# EasyEDA Pro project six-port-baseboard-v01.epro, schematic 六接口底板_V01, sheets 5 to 10 of 12

## Sheets
5 02_FR胎温控制器: Schematic Name: 六接口底板_V01
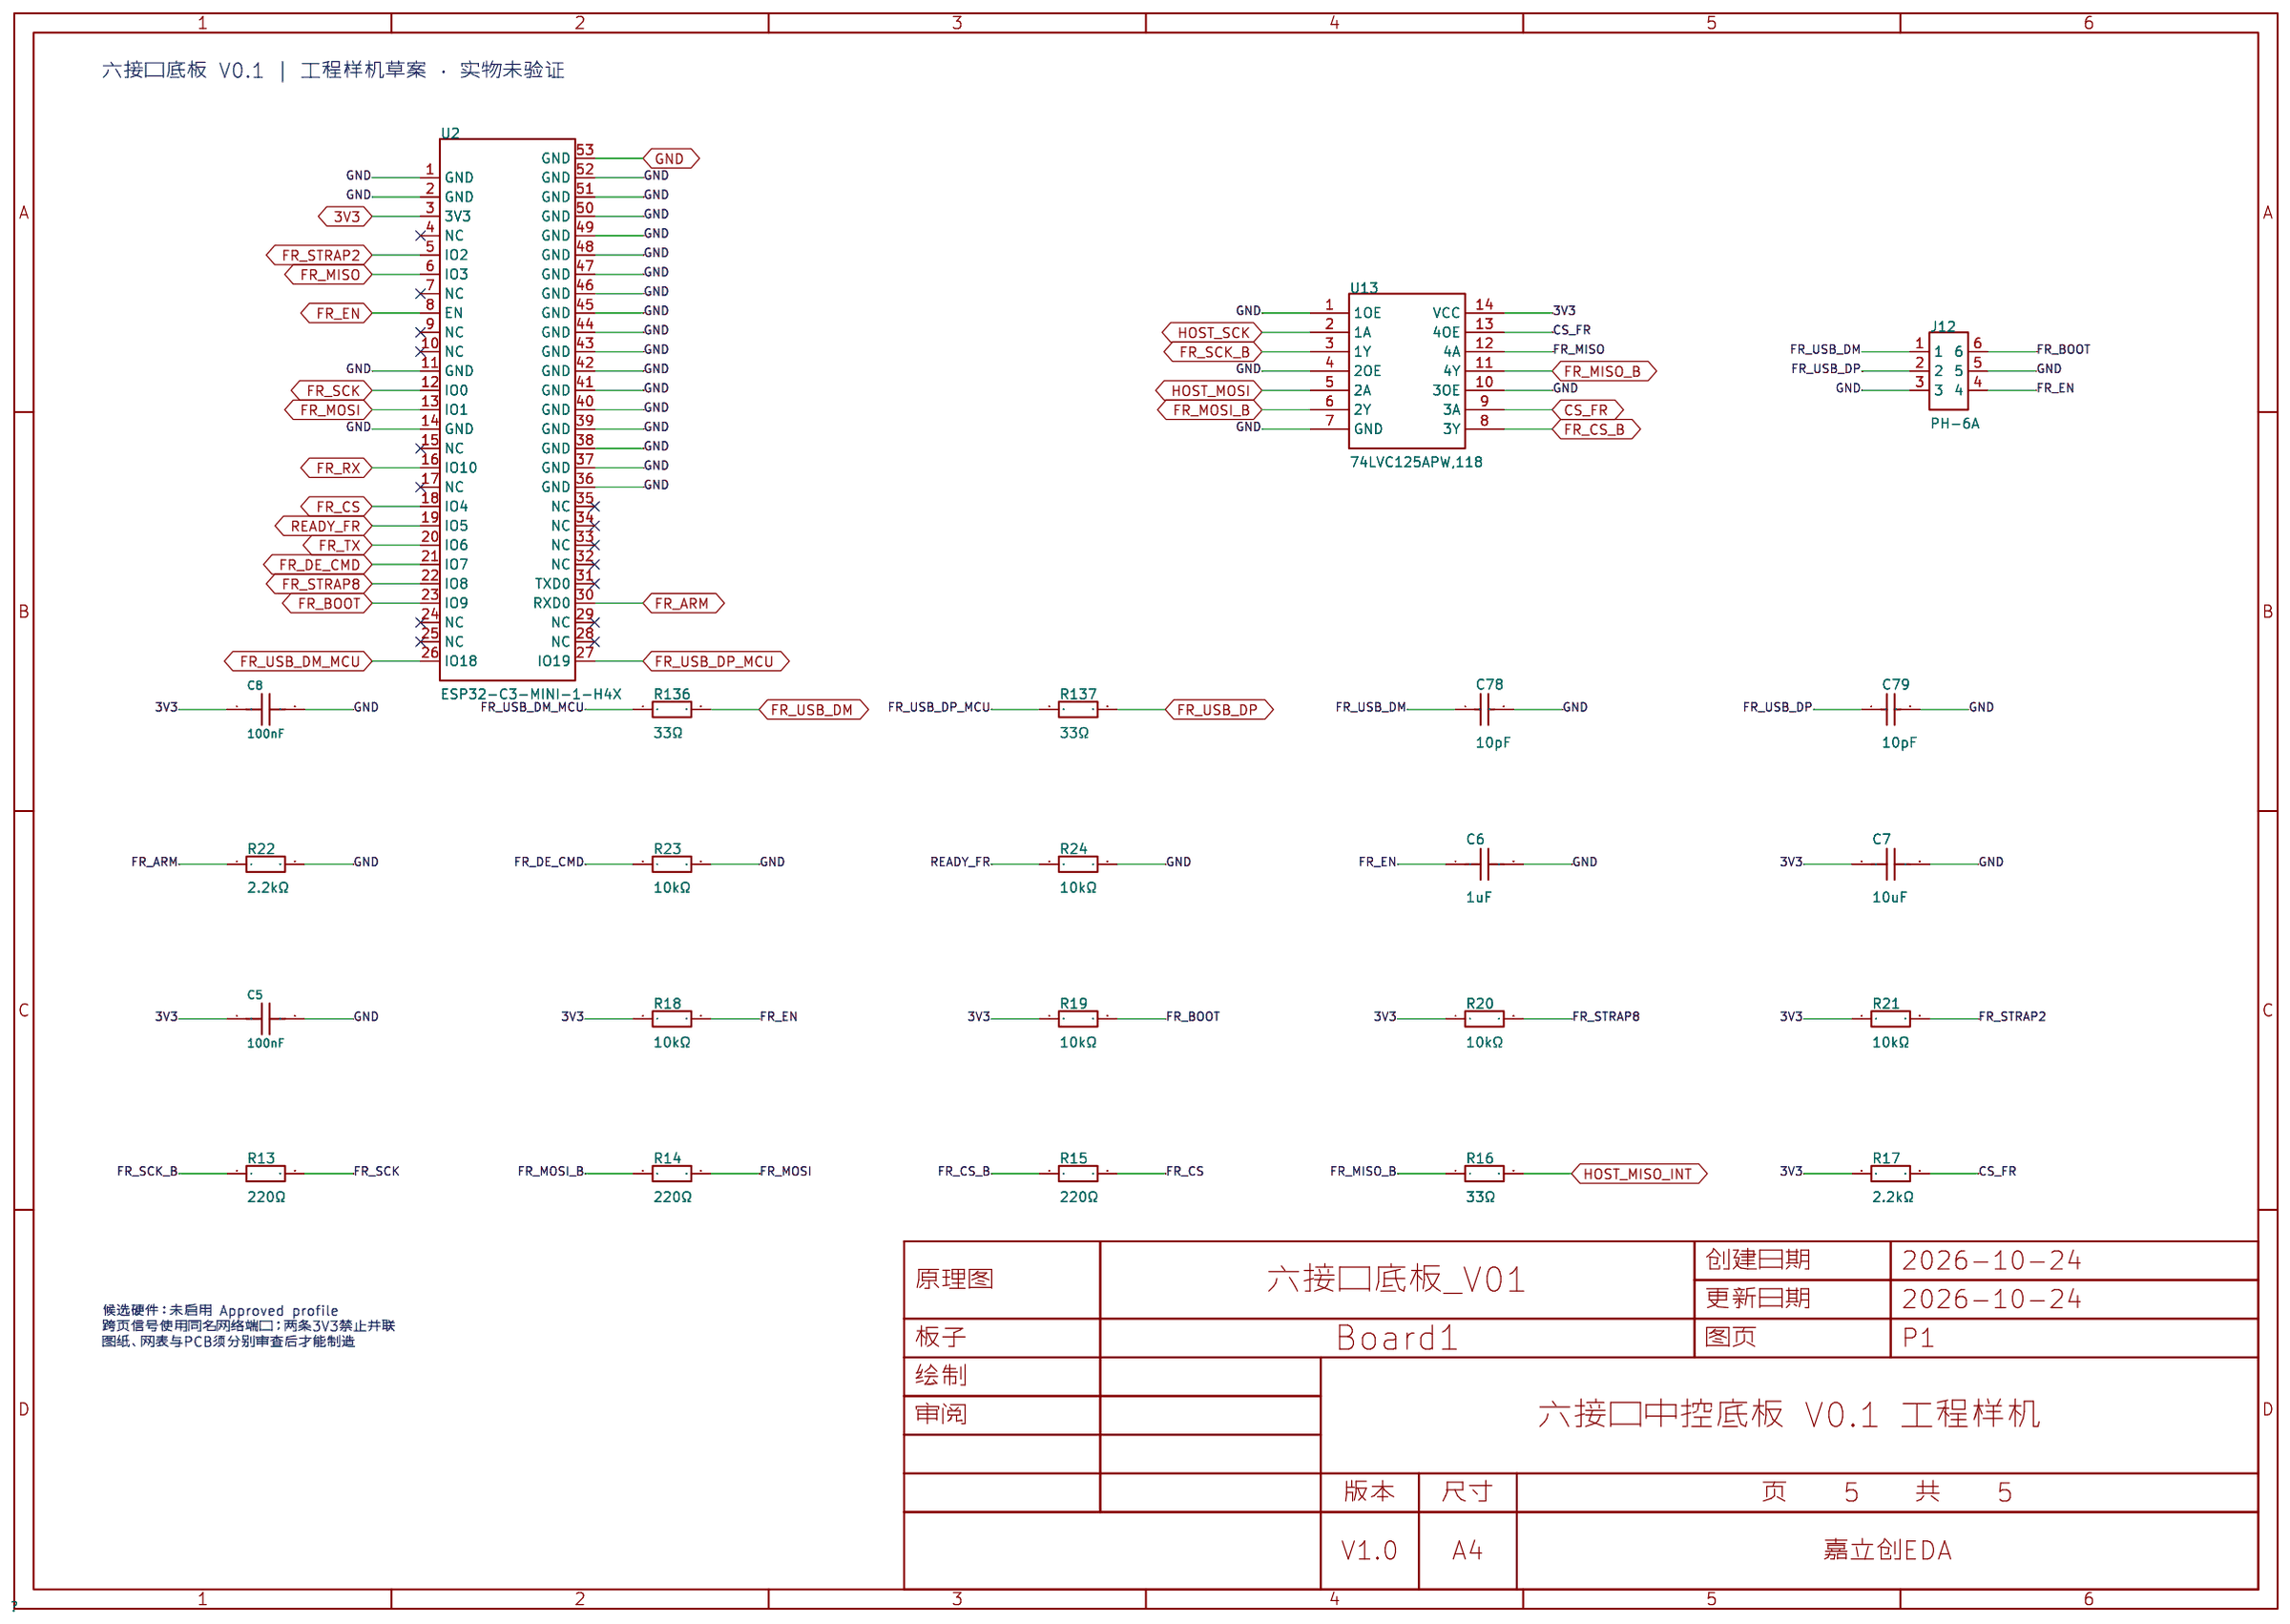
[diagram p4: 02_FR胎温控制器]
6 03_RL胎温控制器: Schematic Name: 六接口底板_V01
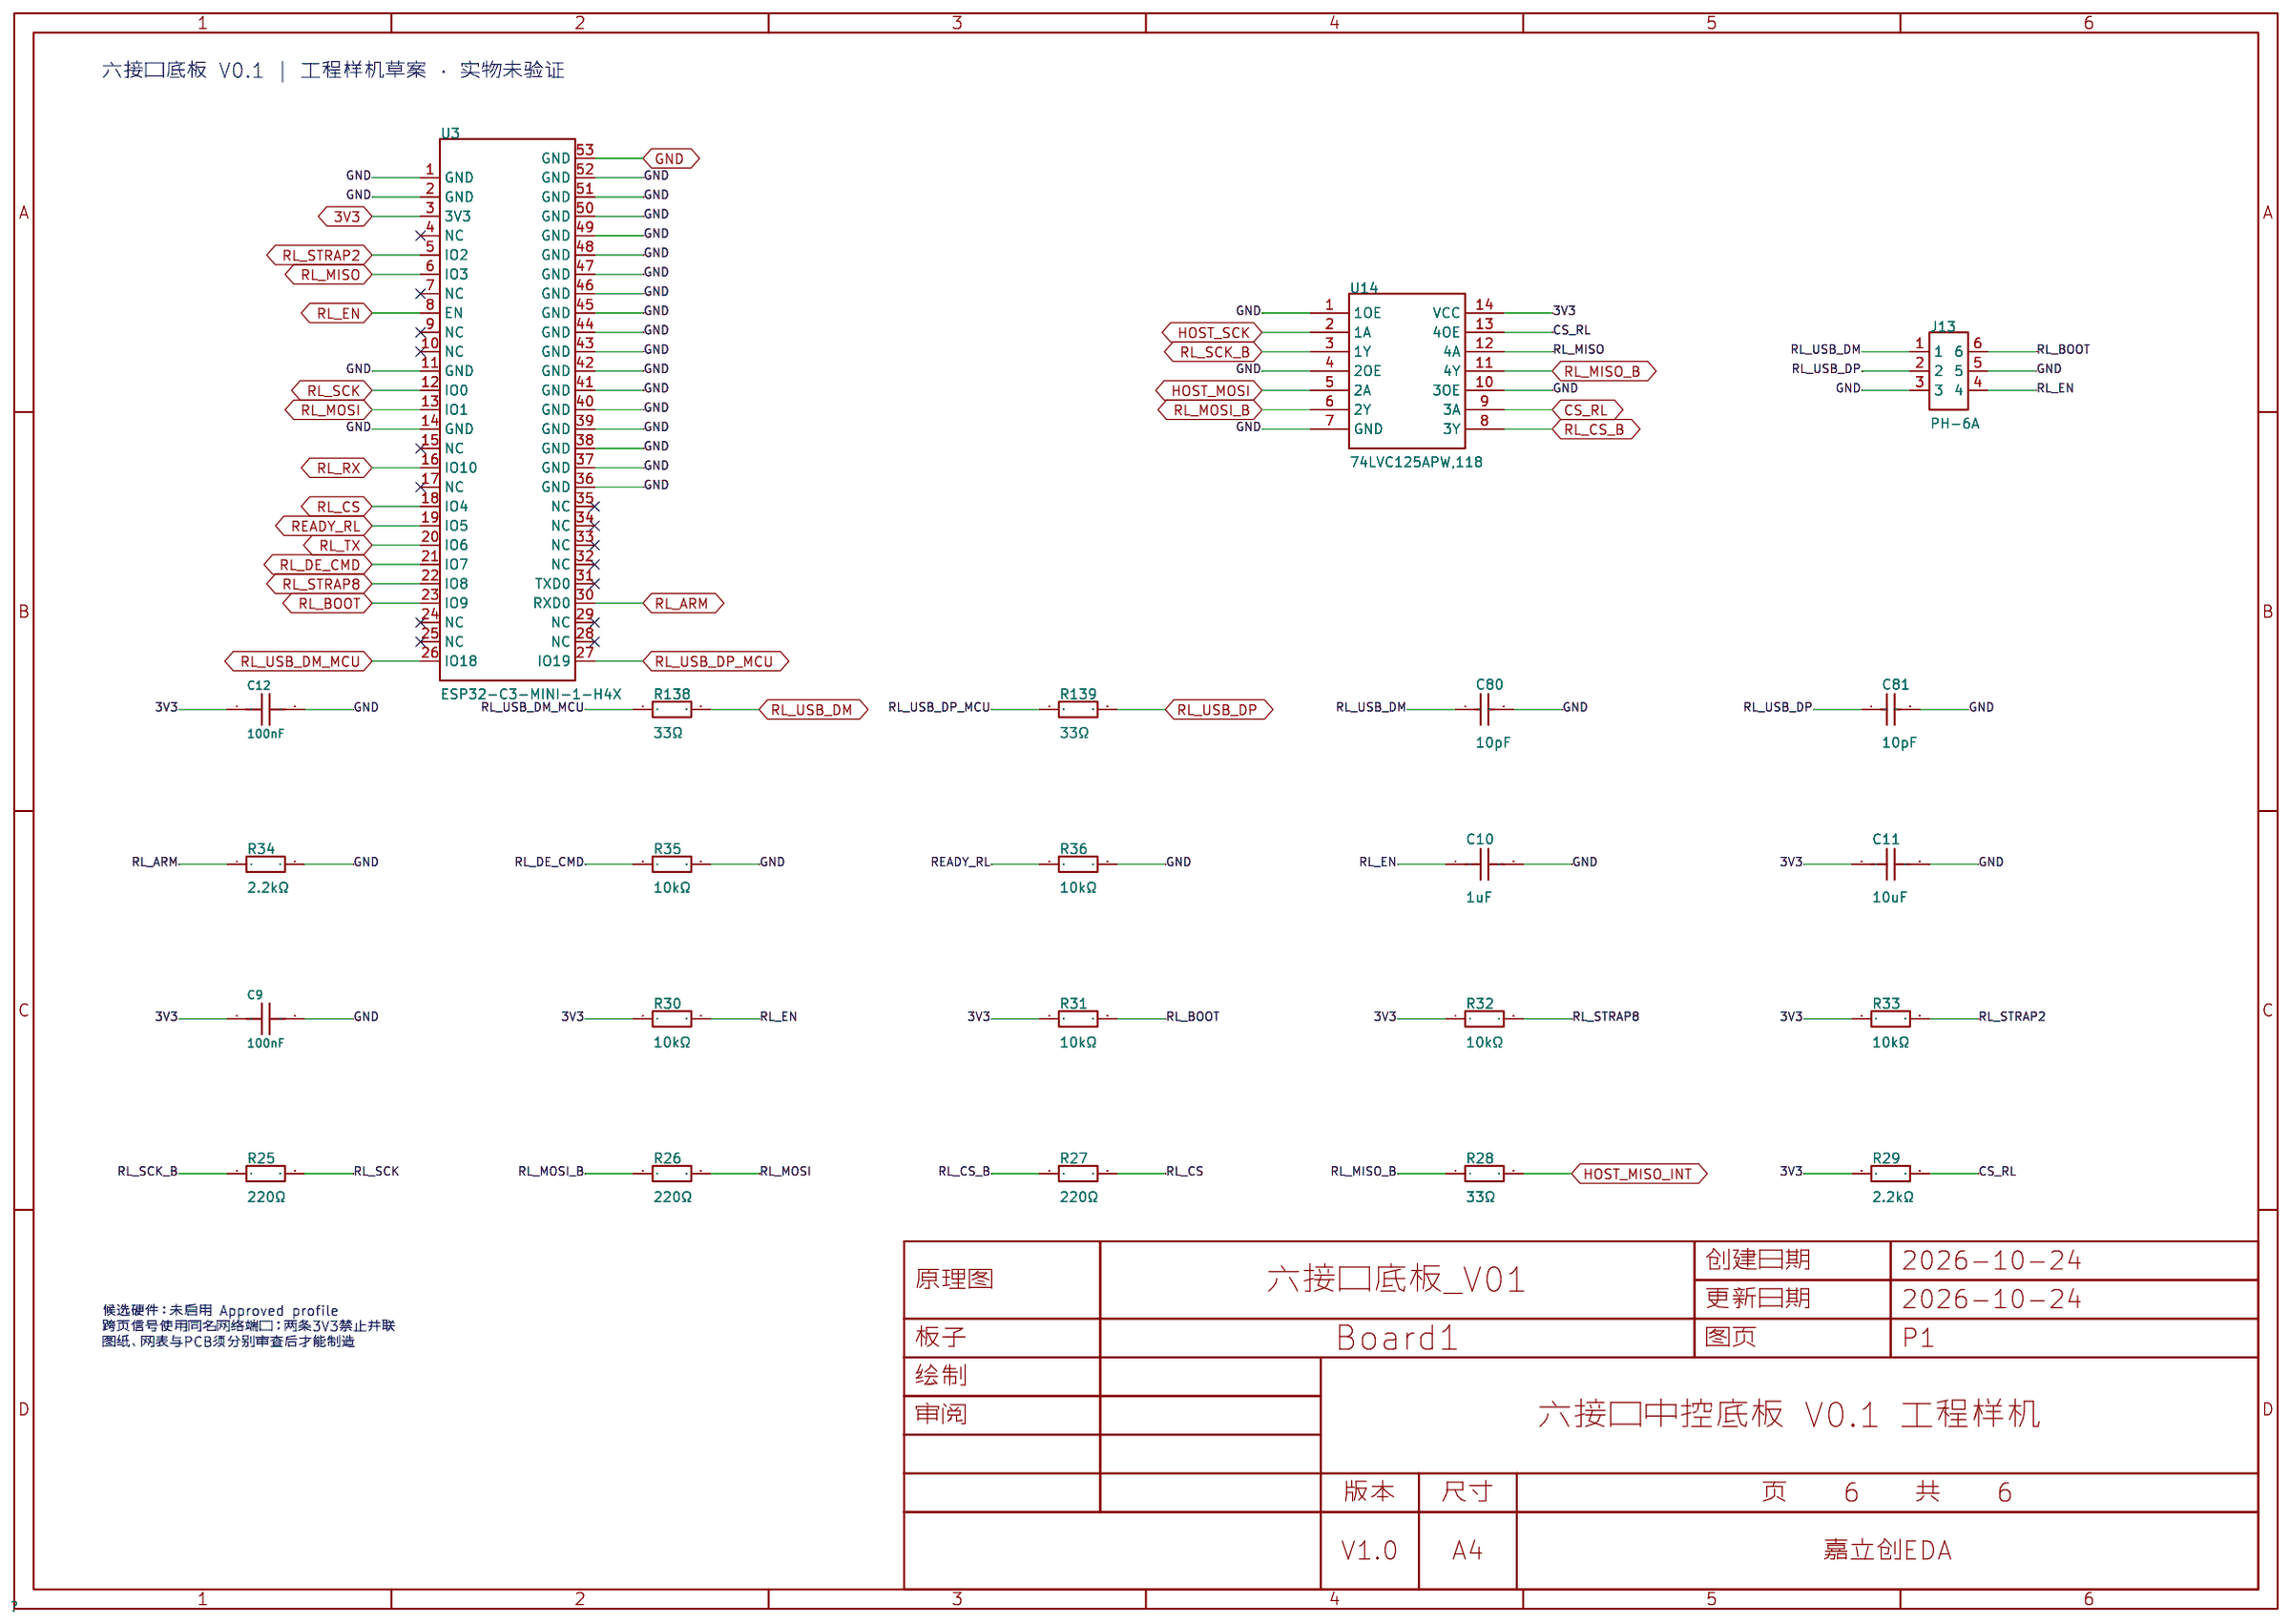
[diagram p5: 03_RL胎温控制器]
7 04_RR胎温控制器: Schematic Name: 六接口底板_V01
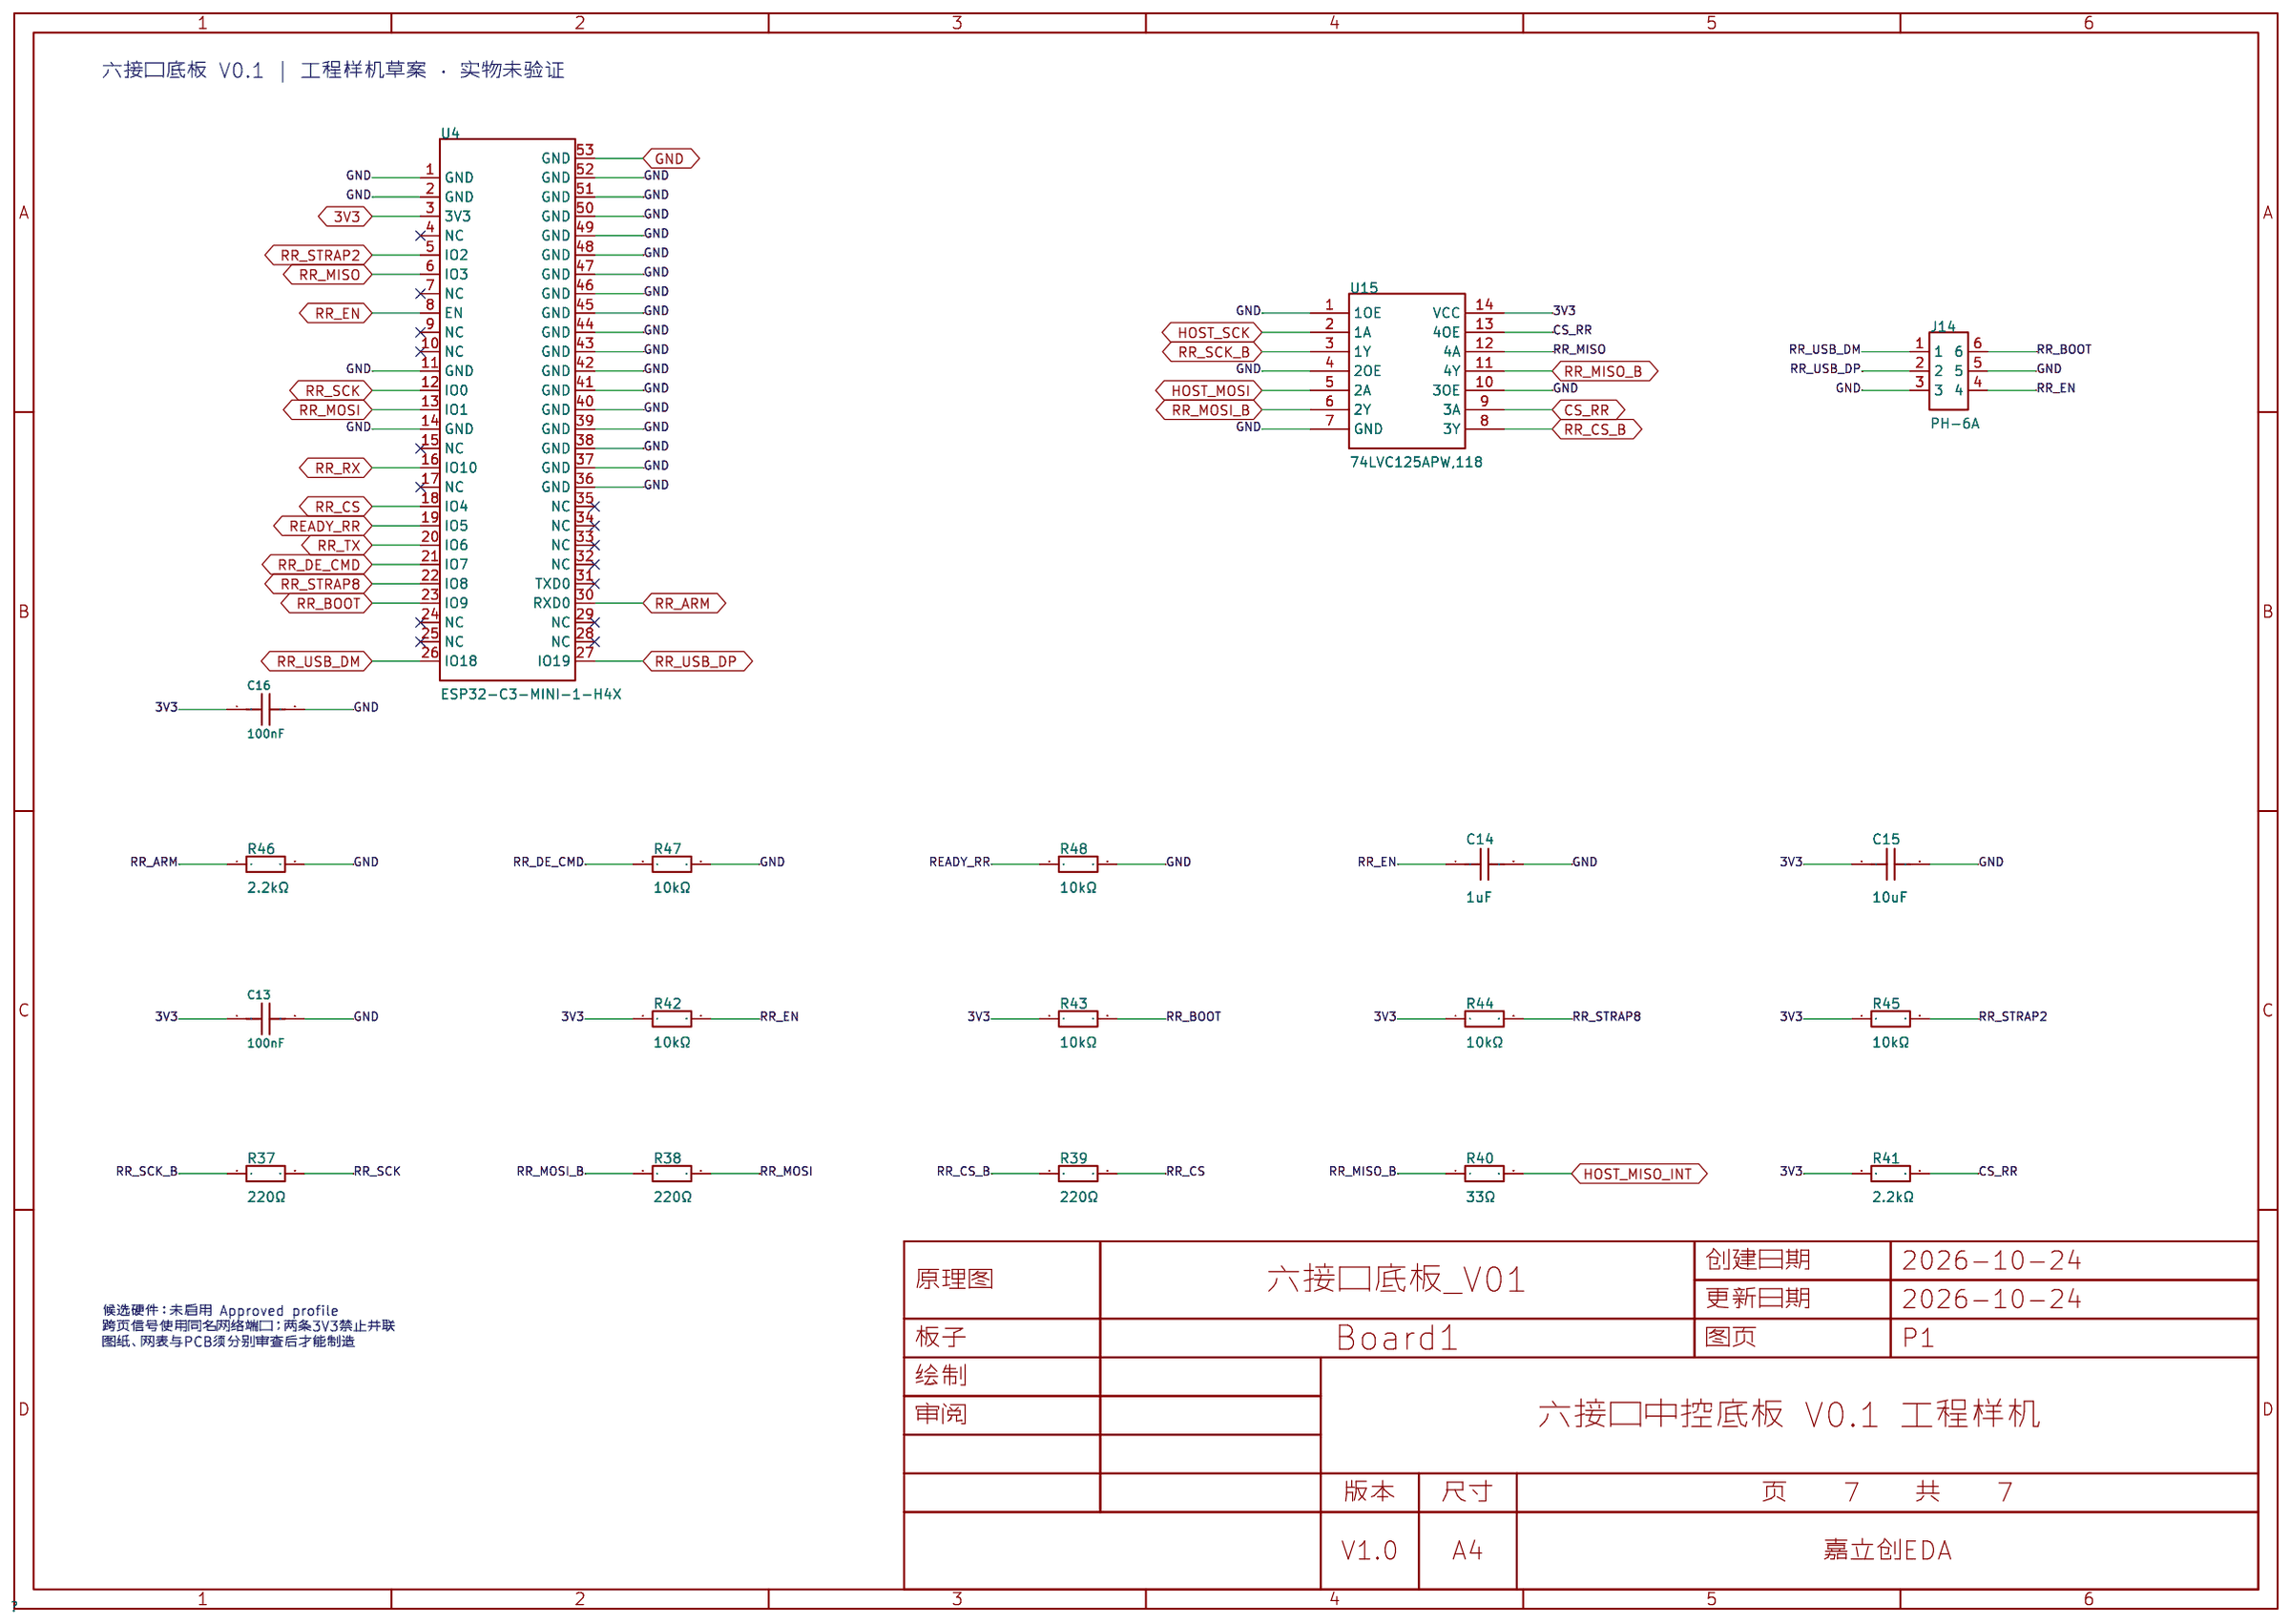
[diagram p6: 04_RR胎温控制器]
8 08_7B与READY选择: Schematic Name: 六接口底板_V01
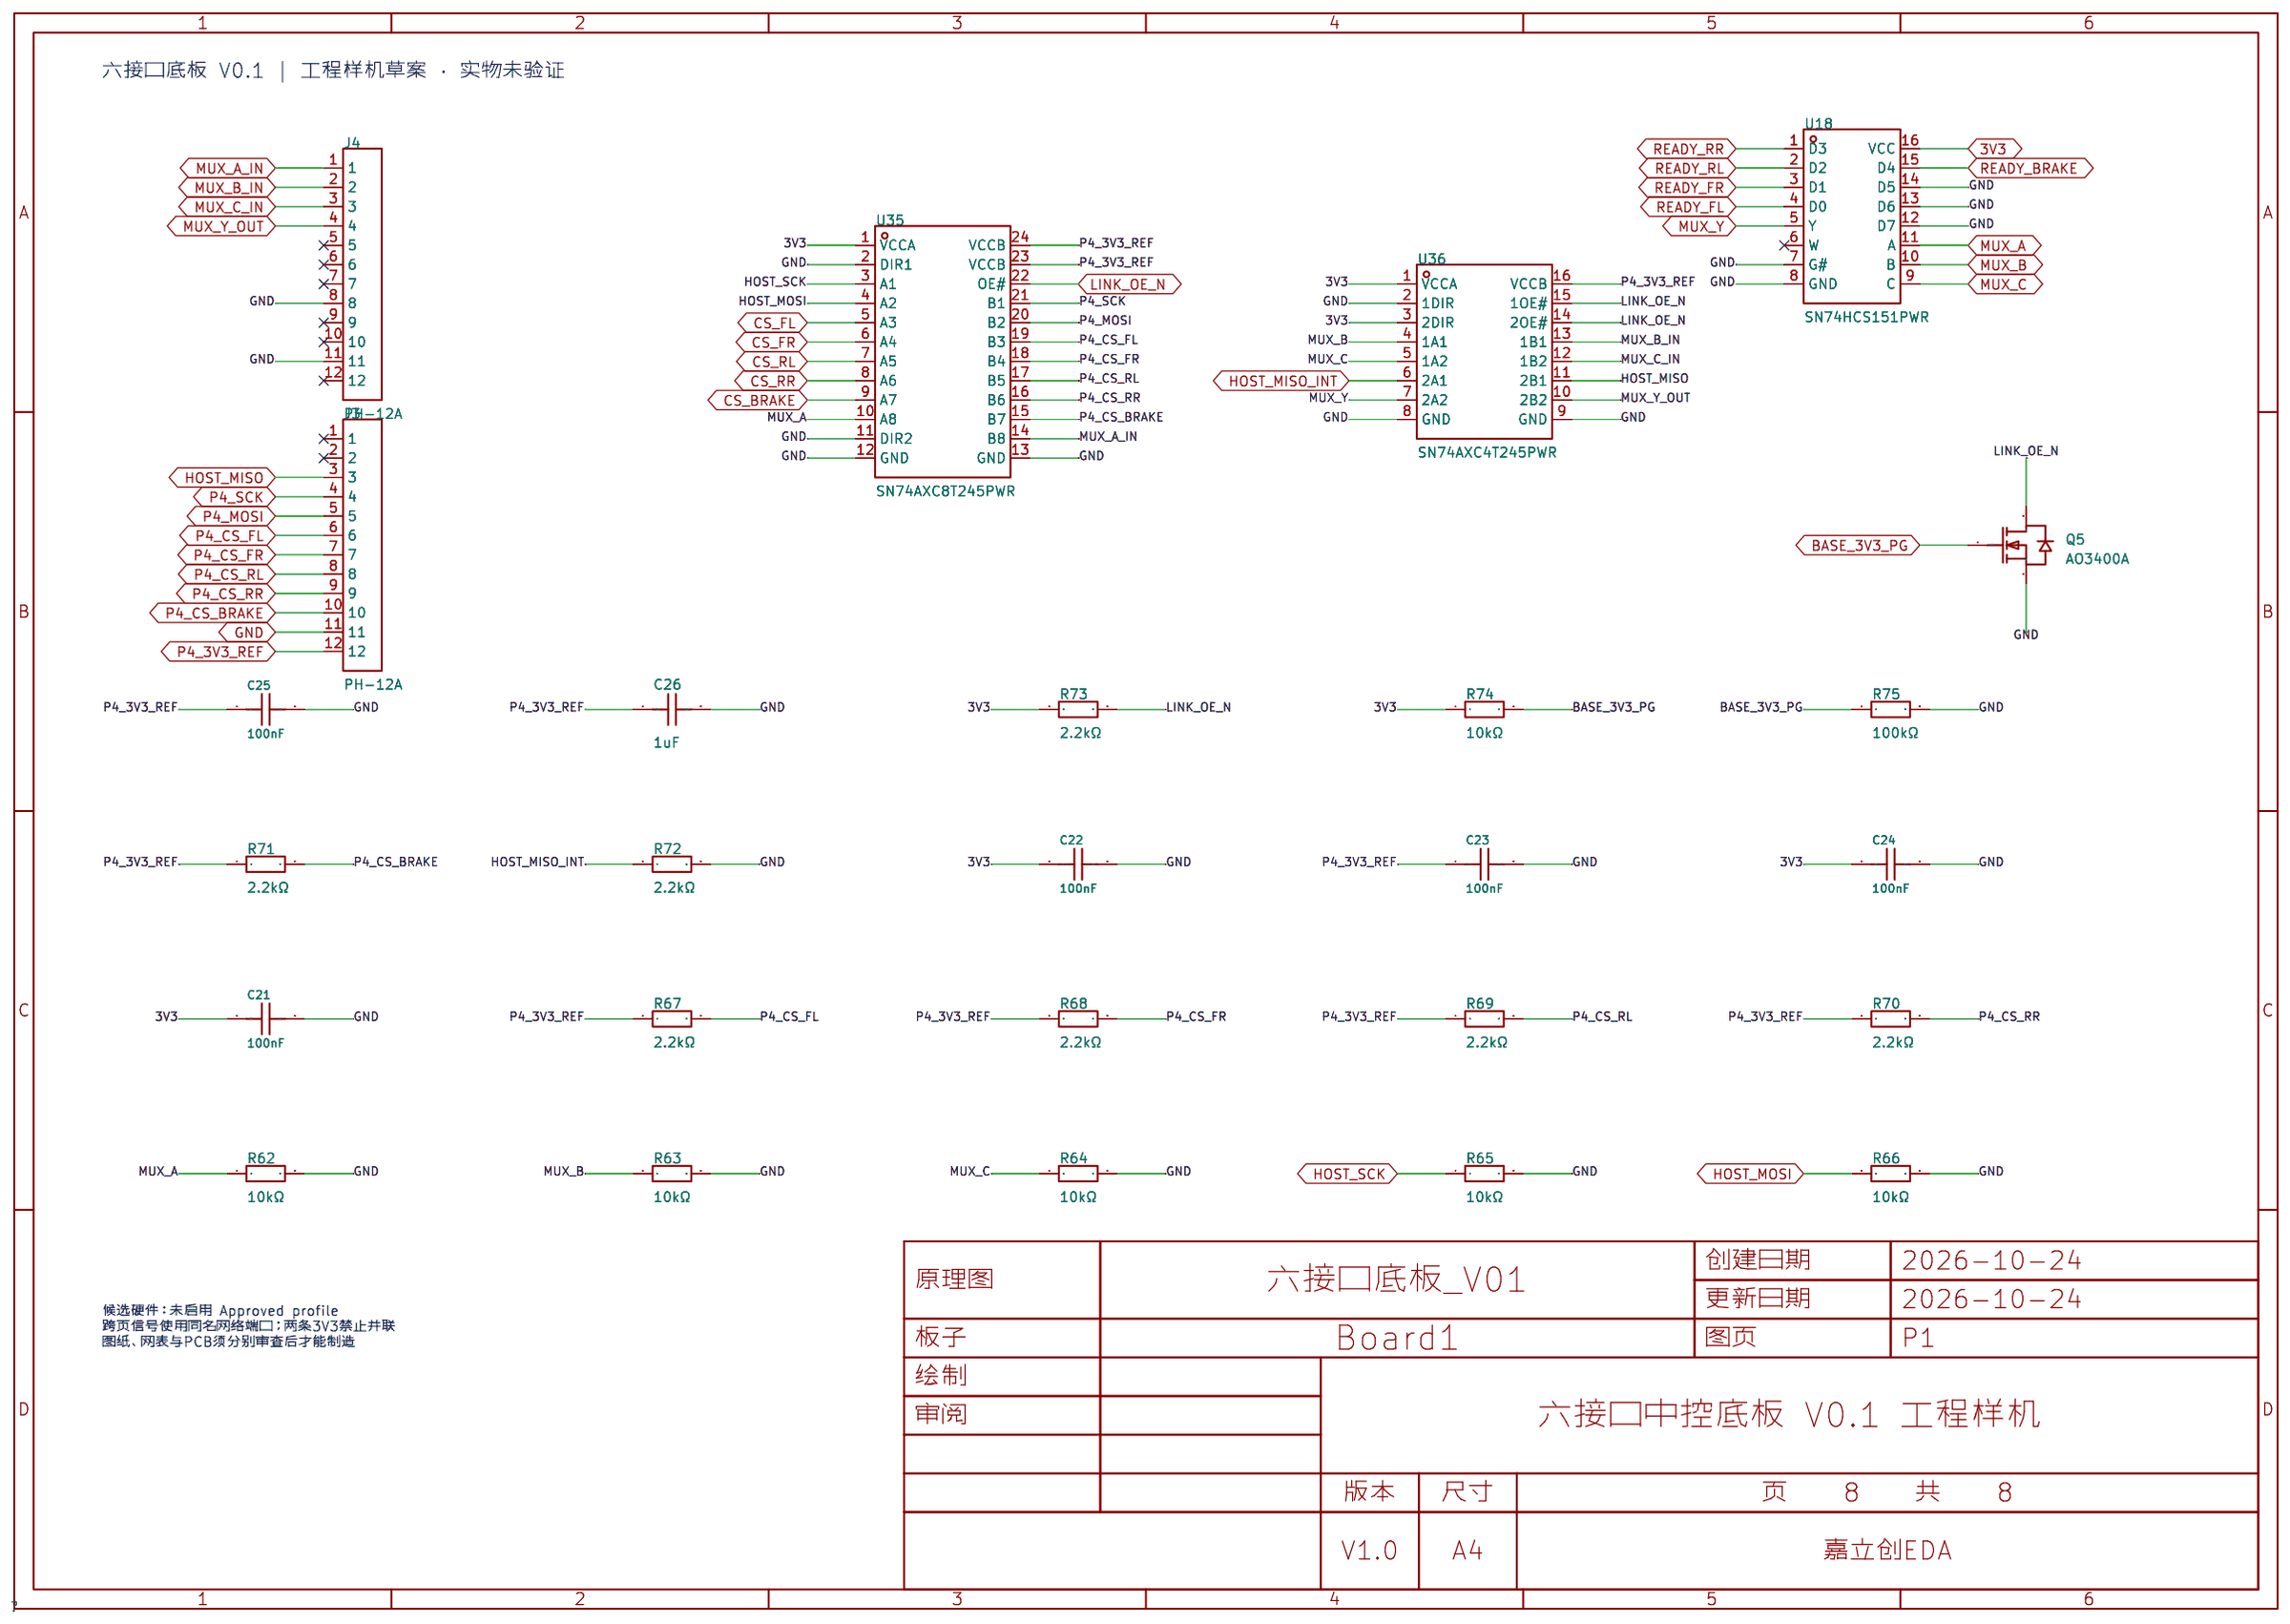
[diagram p7: 08_7B与READY选择]
9 09_双路降压与屏幕电源: Schematic Name: 六接口底板_V01
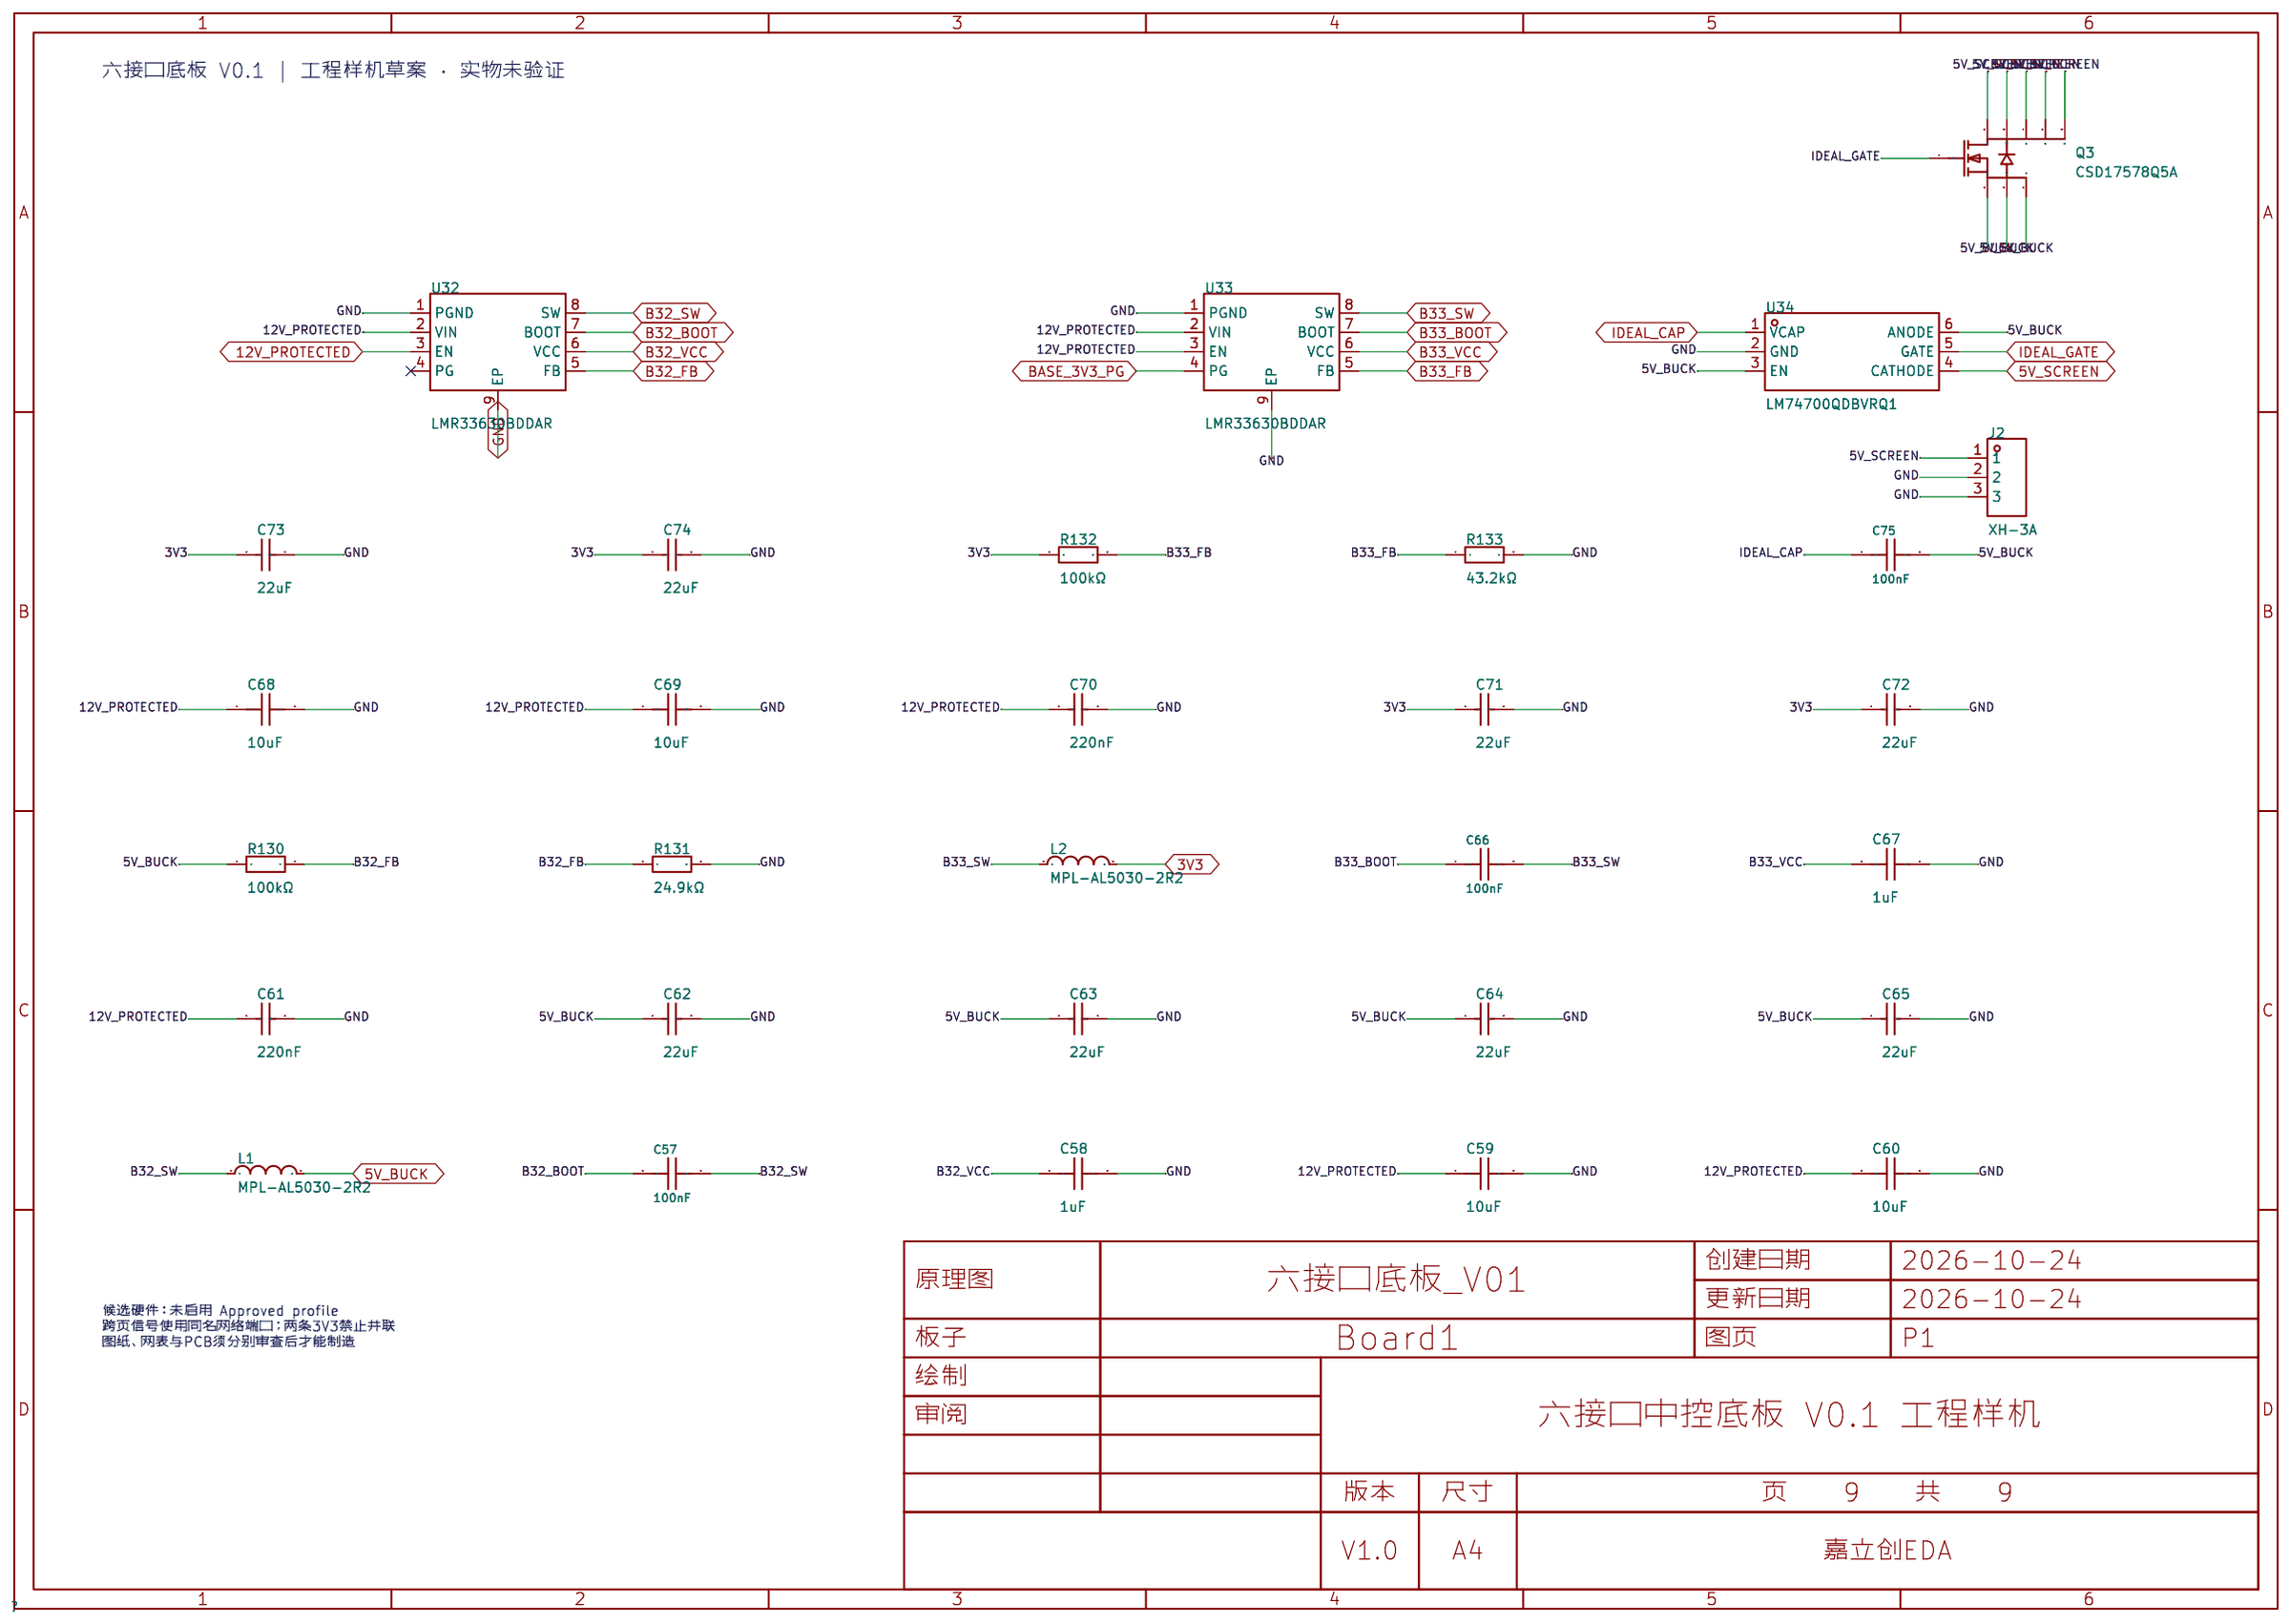
[diagram p8: 09_双路降压与屏幕电源]
10 10_FL-FR支路无源器件: Schematic Name: 六接口底板_V01
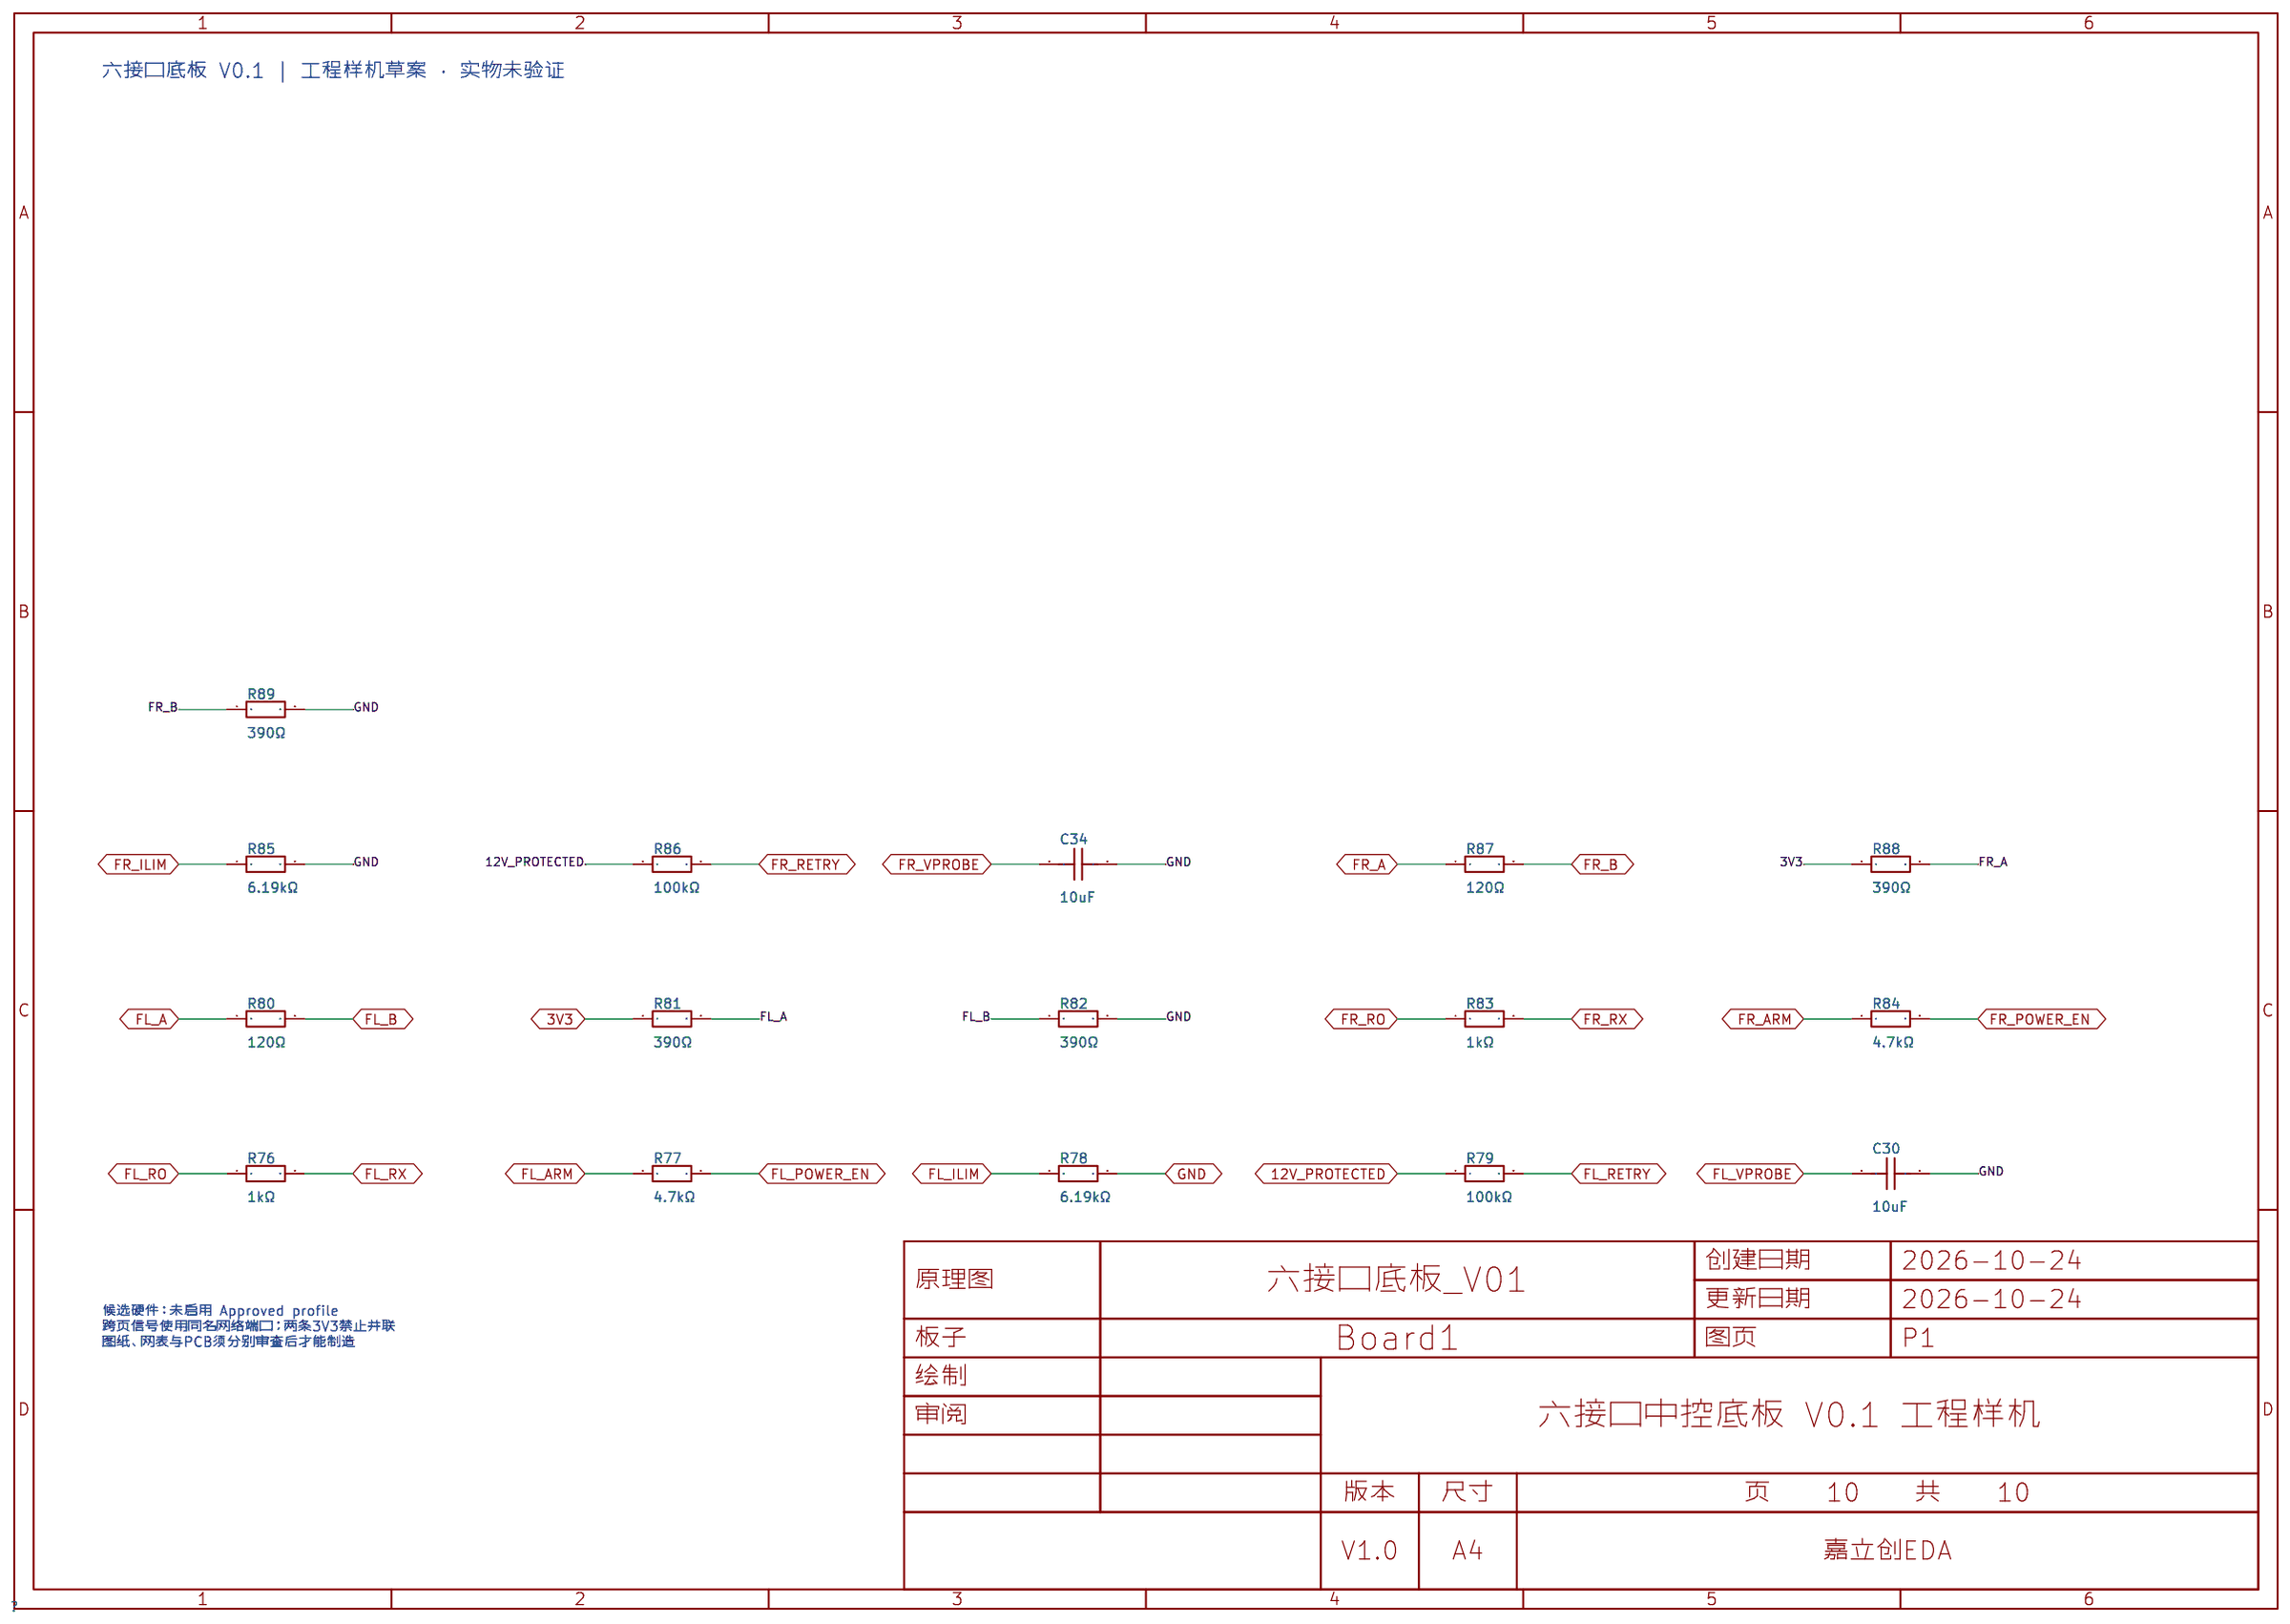
[diagram p9: 10_FL-FR支路无源器件]

## Parts
sheet 02_FR胎温控制器
C5  100nF  [C0603]
C6  1uF  [C0603]
C7  10uF  [C0805]
C8  100nF  [C0603]
C78  10pF  [C0603]  (no BOM)
C79  10pF  [C0603]  (no BOM)
J12  PH-6A  [CONN-TH_6P-P2.00_B6B-PH-K-1]
R13  220Ω  [R0603]
R14  220Ω  [R0603]
R15  220Ω  [R0603]
R16  33Ω  [R0603]
R17  2.2kΩ  [R0603]
R18  10kΩ  [R0603]
R19  10kΩ  [R0603]
R20  10kΩ  [R0603]
R21  10kΩ  [R0603]
R22  2.2kΩ  [R0603]
R23  10kΩ  [R0603]
R24  10kΩ  [R0603]
R136  33Ω  [R0603]
R137  33Ω  [R0603]
U2  2.4GHz  [WIFIM-SMD_ESP32-C3-MINI-1]
U13  74LVC125APW,118  [TSSOP-14_L5.0-W4.4-P0.65-LS6.4-BL]
sheet 03_RL胎温控制器
C9  100nF  [C0603]
C10  1uF  [C0603]
C11  10uF  [C0805]
C12  100nF  [C0603]
C80  10pF  [C0603]  (no BOM)
C81  10pF  [C0603]  (no BOM)
J13  PH-6A  [CONN-TH_6P-P2.00_B6B-PH-K-1]
R25  220Ω  [R0603]
R26  220Ω  [R0603]
R27  220Ω  [R0603]
R28  33Ω  [R0603]
R29  2.2kΩ  [R0603]
R30  10kΩ  [R0603]
R31  10kΩ  [R0603]
R32  10kΩ  [R0603]
R33  10kΩ  [R0603]
R34  2.2kΩ  [R0603]
R35  10kΩ  [R0603]
R36  10kΩ  [R0603]
R138  33Ω  [R0603]
R139  33Ω  [R0603]
U3  2.4GHz  [WIFIM-SMD_ESP32-C3-MINI-1]
U14  74LVC125APW,118  [TSSOP-14_L5.0-W4.4-P0.65-LS6.4-BL]
sheet 04_RR胎温控制器
C13  100nF  [C0603]
C14  1uF  [C0603]
C15  10uF  [C0805]
C16  100nF  [C0603]
J14  PH-6A  [CONN-TH_6P-P2.00_B6B-PH-K-1]
R37  220Ω  [R0603]
R38  220Ω  [R0603]
R39  220Ω  [R0603]
R40  33Ω  [R0603]
R41  2.2kΩ  [R0603]
R42  10kΩ  [R0603]
R43  10kΩ  [R0603]
R44  10kΩ  [R0603]
R45  10kΩ  [R0603]
R46  2.2kΩ  [R0603]
R47  10kΩ  [R0603]
R48  10kΩ  [R0603]
U4  2.4GHz  [WIFIM-SMD_ESP32-C3-MINI-1]
U15  74LVC125APW,118  [TSSOP-14_L5.0-W4.4-P0.65-LS6.4-BL]
sheet 08_7B与READY选择
C21  100nF  [C0603]
C22  100nF  [C0603]
C23  100nF  [C0603]
C24  100nF  [C0603]
C25  100nF  [C0603]
C26  1uF  [C0603]
J3  PH-12A  [CONN-TH_PH-12A]
J4  PH-12A  [CONN-TH_PH-12A]
Q5  AO3400A  [SOT-23-3_L2.9-W1.3-P1.90-LS2.4-BR]
R62  10kΩ  [R0603]
R63  10kΩ  [R0603]
R64  10kΩ  [R0603]
R65  10kΩ  [R0603]
R66  10kΩ  [R0603]
R67  2.2kΩ  [R0603]
R68  2.2kΩ  [R0603]
R69  2.2kΩ  [R0603]
R70  2.2kΩ  [R0603]
R71  2.2kΩ  [R0603]
R72  2.2kΩ  [R0603]
R73  2.2kΩ  [R0603]
R74  10kΩ  [R0603]
R75  100kΩ  [R0603]
U18  SN74HCS151PWR  [TSSOP-16_L5.0-W4.4-P0.65-LS6.4-BL]
U35  SN74AXC8T245PWR  [TSSOP-24_L7.8-W4.4-P0.65-LS6.4-BL]
U36  SN74AXC4T245PWR  [TSSOP-16_L5.0-W4.4-P0.65-LS6.4-BL]
sheet 09_双路降压与屏幕电源
C57  100nF  [C0603]
C58  1uF  [C0603]
C59  10uF  [C0805]
C60  10uF  [C0805]
C61  220nF  [C0603]
C62  22uF  [C1206]
C63  22uF  [C1206]
C64  22uF  [C1206]
C65  22uF  [C1206]
C66  100nF  [C0603]
C67  1uF  [C0603]
C68  10uF  [C0805]
C69  10uF  [C0805]
C70  220nF  [C0603]
C71  22uF  [C1206]
C72  22uF  [C1206]
C73  22uF  [C1206]
C74  22uF  [C1206]
C75  100nF  [C0603]
J2  XH-3A  [CONN-TH_XH-3A]
L1  2.2uH  [IND-SMD_L5.5-W5.3_XGL5030]
L2  2.2uH  [IND-SMD_L5.5-W5.3_XGL5030]
Q3  CSD17578Q5A  [DFN-8_L5.8-W4.9-P1.27-LS6.0-BL-1]
R130  100kΩ  [R0603]
R131  24.9kΩ  [R0603]
R132  100kΩ  [R0603]
R133  43.2kΩ  [R0603]
U32  LMR33630BDDAR  [SOIC-8_L4.9-W3.9-P1.27-LS6.0-BL-EP2.8-1]
U33  LMR33630BDDAR  [SOIC-8_L4.9-W3.9-P1.27-LS6.0-BL-EP2.8-1]
U34  LM74700QDBVRQ1  [SOT-23-6_L2.9-W1.6-P0.95-LS2.8-BR]
sheet 10_FL-FR支路无源器件
C30  10uF  [C0805]
C34  10uF  [C0805]
R76  1kΩ  [R0603]
R77  4.7kΩ  [R0603]
R78  6.19kΩ  [R0603]
R79  100kΩ  [R0603]
R80  120Ω  [R0603]  (no BOM)
R81  390Ω  [R0603]  (no BOM)
R82  390Ω  [R0603]  (no BOM)
R83  1kΩ  [R0603]
R84  4.7kΩ  [R0603]
R85  6.19kΩ  [R0603]
R86  100kΩ  [R0603]
R87  120Ω  [R0603]  (no BOM)
R88  390Ω  [R0603]  (no BOM)
R89  390Ω  [R0603]  (no BOM)

## Library data of the parts
C5 C8 C9 C12 C13 C16 C21-C25 C57 C66 C75 = CC0603KRX7R9BB104: 容值:100nF;精度:±10%;额定电压:50V;温度系数:X7R;; LCSC Part Name: 100nF ±10% 50V; Supplier Part: C14663; Manufacturer: YAGEO(国巨); Supplier Footprint: 0603; JLCPCB Part Class: Basic Part; Datasheet: https://item.szlcsc.com/datasheet/CC0603KRX7R9BB104/15331.html; Supplier: LCSC; Tolerance: ±10%; Voltage Rating: 50V; Temperature Coefficient: X7R; Catalog UUID: 96b39256cc3f4d80bd3b503deb4f3328; DNP: false
C6 C10 C14 C26 C58 C67 = CL10A105KB8NNNC: 容值:1uF;精度:±10%;额定电压:50V;温度系数:X5R;; LCSC Part Name: 1uF ±10% 50V; Supplier Part: C15849; Manufacturer: SAMSUNG(三星); Supplier Footprint: 0603; JLCPCB Part Class: Basic Part; Datasheet: https://item.szlcsc.com/datasheet/CL10A105KB8NNNC/16531.html; Supplier: LCSC; Tolerance: ±10%; Voltage Rating: 50V; Temperature Coefficient: X5R; Catalog UUID: f4744ff7405a46a48e360c2c6fadeca3; DNP: false
C7 C11 C15 C30 C34 = CL21A106KAYNNNE_C15850: 容值:10uF;精度:±10%;额定电压:25V;温度系数:X5R;; LCSC Part Name: 10uF ±10% 25V; Supplier Part: C15850; Manufacturer: SAMSUNG(三星); Manufacturer Part: CL21A106KAYNNNE; Supplier Footprint: 0805; JLCPCB Part Class: Basic Part; Datasheet: https://item.szlcsc.com/datasheet/CL21A106KAYNNNE/16532.html; Supplier: LCSC; Tolerance: ±10%; Voltage Rating: 25V; Temperature Coefficient: X5R; Catalog UUID: 8c1f4a9e9d204b148b36ce719c891bd1; DNP: false
C78-C81 = CL10C100JB8NNNC: 容值:10pF;精度:±5%;额定电压:50V;温度系数:C0G;; LCSC Part Name: 10pF ±5% 50V; Supplier Part: C1634; Manufacturer: SAMSUNG(三星); Supplier Footprint: 0603; JLCPCB Part Class: Basic Part; Datasheet: https://item.szlcsc.com/datasheet/CL10C100JB8NNNC/1986.html; Supplier: LCSC; Tolerance: ±5%; Voltage Rating: 50V; Temperature Coefficient: C0G; Catalog UUID: cce6c24475c147de9dedbc04bb9e84e4; DNP: true; Engineering Note: USB tuning10pF reserve; DNP initially; do not fit without signal-integrity validation
J12-J14 = PH-6A: Supplier Part: C9900011373; JLCPCB Part Class: Extended Part; Supplier: LCSC; Catalog UUID: 557868997cb2445e94ef98c066678616; DNP: false; Engineering Note: Native USB jig only; no VBUS or UART0 RX; external 12V supply required
R13-R15 R25-R27 R37-R39 = 0603WAF2200T5E: 电阻类型:厚膜电阻;阻值:220Ω;精度:±1%;功率:100mW;最大工作电压:75V;温度系数:±100ppm/℃;; LCSC Part Name: 220Ω ±1% 100mW 厚膜电阻; Supplier Part: C22962; Manufacturer: UNI-ROYAL(厚声); Supplier Footprint: 0603; JLCPCB Part Class: Basic Part; Datasheet: https://atta.szlcsc.com/upload/public/pdf/source/20200306/C422600_1E6D84923E4A46A82E41ADD87F860B5C.pdf; Supplier: LCSC; Type: 厚膜电阻; Tolerance: ±1%; Power(Watts): 100mW; Overload Voltage (Max): 75V; Temperature Coefficient: ±100ppm/℃; Operating Temperature Range: -55℃~+155℃; Catalog UUID: 5838c5089bf2441c9c491337f593e7a2; DNP: false
R16 R28 R40 = 0603WAF330JT5E: 电阻类型:厚膜电阻;阻值:33Ω;精度:±1%;功率:100mW;工作电压:75V;温度系数:±100ppm/℃;; LCSC Part Name: 33Ω ±1% 100mW 厚膜电阻; Supplier Part: C23140; Manufacturer: UNI-ROYAL(厚声); Supplier Footprint: 0603; JLCPCB Part Class: Basic Part; Datasheet: https://item.szlcsc.com/datasheet/0603WAF330JT5E/23867.html; Supplier: LCSC; Type: 厚膜电阻; Tolerance: ±1%; Power(Watts): 100mW; Voltage-Supply(Max): 75V; Temperature Coefficient: ±100ppm/℃; Operating Temperature: -55℃~+155℃; Catalog UUID: c1b17fa23f304726bc91c5924d9b7c0f; DNP: false
R17 R22 R29 R34 R41 R46 R67-R73 = 0603WAF2201T5E: 电阻类型:厚膜电阻;阻值:2.2kΩ;精度:±1%;功率:100mW;工作电压:75V;温度系数:±100ppm/℃;; LCSC Part Name: 厚膜电阻 2.2kΩ ±1%; Supplier Part: C4190; Manufacturer: UNI-ROYAL(厚声); Supplier Footprint: 0603; JLCPCB Part Class: Basic Part; Datasheet: https://item.szlcsc.com/datasheet/0603WAF2201T5E/4597.html; Supplier: LCSC; Type: 厚膜电阻; Tolerance: ±1%; Power(Watts): 100mW; Voltage-Supply(Max): 75V; Temperature Coefficient: ±100ppm/℃; Operating Temperature: -55℃~+155℃; Catalog UUID: 98df714a70bd4b05a6b4009c95d1c8aa; DNP: false
R18-R21 R23 R24 R30-R33 R35 R36 R42-R45 R47 R48 R62-R66 R74 = 0603WAF1002T5E: 电阻类型:厚膜电阻;阻值:10kΩ;精度:±1%;功率:100mW;工作电压:75V;温度系数:±100ppm/℃;; LCSC Part Name: 厚膜电阻 10kΩ ±1% 100mW; Supplier Part: C25804; Manufacturer: UNI-ROYAL(厚声); Supplier Footprint: 0603; JLCPCB Part Class: Basic Part; Datasheet: https://item.szlcsc.com/datasheet/0603WAF1002T5E/26547.html; Supplier: LCSC; Type: 厚膜电阻; Tolerance: ±1%; Power(Watts): 100mW; Voltage-Supply(Max): 75V; Temperature Coefficient: ±100ppm/℃; Operating Temperature: -55℃~+155℃; Catalog UUID: b948db94476e4027ac8953235755ec96; DNP: false
R136-R139 = 0603WAF330JT5E: 电阻类型:厚膜电阻;阻值:33Ω;精度:±1%;功率:100mW;工作电压:75V;温度系数:±100ppm/℃;; LCSC Part Name: 33Ω ±1% 100mW 厚膜电阻; Supplier Part: C23140; Manufacturer: UNI-ROYAL(厚声); Supplier Footprint: 0603; JLCPCB Part Class: Basic Part; Datasheet: https://item.szlcsc.com/datasheet/0603WAF330JT5E/23867.html; Supplier: LCSC; Type: 厚膜电阻; Tolerance: ±1%; Power(Watts): 100mW; Voltage-Supply(Max): 75V; Temperature Coefficient: ±100ppm/℃; Operating Temperature: -55℃~+155℃; Catalog UUID: c1b17fa23f304726bc91c5924d9b7c0f; Engineering Note: USB source termination33ohm
U2-U4 = ESP32-C3-MINI-1-H4X: 核心芯片:ESP32-C3FH4;频率:2.4GHz;天线形式:板载PCB天线;发射功率:20.5dBm;接收灵敏度:-104dBm;; LCSC Part Name: 不带固件 支持2.4GHz Wi-Fi和蓝牙5的小尺寸模组; Supplier Part: C41349510; Manufacturer: ESPRESSIF(乐鑫); Supplier Footprint: SMD,16.6x13.2mm; JLCPCB Part Class: Extended Part; Datasheet: https://item.szlcsc.com/datasheet/ESP32-C3-MINI-1-H4X/43083447.html; Supplier: LCSC; Utilized IC / Part: ESP32-C3FH4; Interface Type: I2C；GPIO；UART；SPI；USB；I2S; Antenna Type: 板载PCB天线; Output Power: 20.5dBm; Voltage - Supply: 3V~3.6V; Receive  Current: 82mA; Send  Current: 350mA; Sensitivity: -104dBm; Operating Temperature: -40℃~+105℃; Features: 集成蓝牙功能; Catalog UUID: 3a2c95bbb66e4a86b29302666ff8e443; DNP: false; Engineering Note: GPIO20 ARM 2.2k pulldown; UART0 RX must not connect external UART TX
U13-U15 = 74LVC125APW,118: 输入类型:施密特触发器;工作电压:1.2V~3.6V;元件数:4;每个元件位数:1;灌电流(IOL):24mA;拉电流(IOH):24mA;; LCSC Part Name: 三态输出，带5V容限输入/输出的四路缓冲器/线路驱动器; Supplier Part: C6059; Manufacturer: Nexperia(安世); Supplier Footprint: TSSOP-14; JLCPCB Part Class: Extended Part; Datasheet: https://item.szlcsc.com/datasheet/74LVC125APW%252C118/6525.html; Supplier: LCSC; Input type: 施密特触发器; output type: 三态; Voltage - Supply: 1.2V~3.6V; Number of Elements: 4; Number of Bits per Element: 1; Channel Type: 单向; Current - Output Low(IOL): 24mA; Current - Output High(IOH): 24mA; Logic Family: 74LVC; Operating Temperature: -40℃~+125℃; Quiescent Current: 40uA; Propagation Delay: 2.5ns@3.3V,50pF; Features: 掉电隔离；输出使能；电平转换; Catalog UUID: dd4b769d406d4d4e9b0e38748c7cdf43; DNP: false
J3 = PH-12A: Supplier Part: C9900014590; Supplier Footprint: J12-2.0; JLCPCB Part Class: Extended Part; Supplier: LCSC; Catalog UUID: f6e3694911024d6ba3e3b6160d4df2f7; DNP: false; Engineering Note: 7B P3: 1/2 NC; pin12 powers ONLY display-domain buffers, never join baseboard 3V3
J4 = PH-12A: Supplier Part: C9900014590; Supplier Footprint: J12-2.0; JLCPCB Part Class: Extended Part; Supplier: LCSC; Catalog UUID: f6e3694911024d6ba3e3b6160d4df2f7; DNP: false; Engineering Note: 7B P1: 5/6/7/9/10/12 NC; VO4 and BAT must not be powered here
Q5 = AO3400A_C20917: 数量:1个N沟道;漏源电压(Vdss):30V;连续漏极电流(Id):5.7A;导通电阻(RDS(on)):48mΩ@2.5V;耗散功率(Pd):1.4W;阈值电压(Vgs(th)):1.45V;; LCSC Part Name: N沟道 耐压:30V; Supplier Part: C20917; Manufacturer: AOS; Supplier Footprint: SOT-23; JLCPCB Part Class: Basic Part; Datasheet: https://item.szlcsc.com/datasheet/AO3400A/21629.html; Supplier: LCSC; Number: 1个N沟道; Drain to Source Voltage: 30V; Current - Continuous Drain(Id): 5.7A; RDS(on): 48mΩ@2.5V; Pd - Power Dissipation: 1.4W; Gate Threshold Voltage (Vgs(th)): 1.45V; Gate Charge(Qg): 7nC@10V; Input Capacitance(Ciss): 630pF; Reverse Transfer Capacitance (Crss@Vds): 50pF; Operating Temperature: -55℃~+150℃; Type: N沟道; Output Capacitance(Coss): 75pF; Vgs: ±12V; Catalog UUID: 2b6cc05daeb34c16b9e00706a375fc9f; DNP: false; Engineering Note: Open-drain enable; LMR33630 3V3 PG must be valid before link enabled
R75 R79 R86 R130 R132 = 0603WAF1003T5E: 电阻类型:厚膜电阻;阻值:100kΩ;精度:±1%;功率:100mW;工作电压:75V;温度系数:±100ppm/℃;; LCSC Part Name: 厚膜电阻 100kΩ ±1%; Supplier Part: C25803; Manufacturer: UNI-ROYAL(厚声); Supplier Footprint: 0603; JLCPCB Part Class: Basic Part; Datasheet: https://item.szlcsc.com/datasheet/0603WAF1003T5E/26546.html; Supplier: LCSC; Type: 厚膜电阻; Tolerance: ±1%; Power(Watts): 100mW; Voltage-Supply(Max): 75V; Temperature Coefficient: ±100ppm/℃; Operating Temperature: -55℃~+155℃; Catalog UUID: 40ff282b3d594c33b798d1707d8406cb; DNP: false
U18 = SN74HCS151PWR: 工作电压:2V~6V;输入数/输出数:8/1;灌电流(IOL):7.8mA;拉电流(IOH):7.8mA;; LCSC Part Name: 带施密特触发输入的8选1多路复用器; Supplier Part: C2877065; Manufacturer: TI(德州仪器); Supplier Footprint: TSSOP-16; JLCPCB Part Class: Extended Part; Datasheet: https://www.ti.com/cn/lit/ds/symlink/sn74hcs151.pdf; Supplier: LCSC; Type: 多路复用器; Voltage Supply Source: 单电源; Voltage - Supply: 2V~6V; Number of lines: 8/1; Current - Output Low(IOL): 7.8mA; Current - Output High(IOH): 7.8mA; Operating temperature: -40℃~+125℃; Propagation Delay: 17ns@6V,50pF; Quiescent Current: 100nA; Function: 电平转换; Series: 74HCS; Catalog UUID: d168dd8799224c37be6810fb4cd01475; DNP: false
U35 = SN74AXC8T245PWR: 数据速率:380Mbps;工作电压(VCCA):650mV~3.6V;工作电压(VCCB):650mV~3.6V;元件数:1;每个电路通道数:8;; LCSC Part Name: 具有可配置电压转换和三态输出的8位双电源总线收发器; Supplier Part: C882718; Manufacturer: TI(德州仪器); Supplier Footprint: TSSOP-24; JLCPCB Part Class: Extended Part; Datasheet: https://www.ti.com/cn/lit/ds/symlink/sn74axc8t245.pdf; Supplier: LCSC; Channel Type: 双向; Data Rate: 380Mbps; Voltage - Supply(VCCA): 650mV~3.6V; Voltage - Supply(VCCB): 650mV~3.6V; Number of Elements: 1; Number of Circuits: 8; Output Type: 三态; Operating Temperature: -40℃~+125℃; Features: 断电保护；输出使能高阻; Translator Type: 电平转换器; Catalog UUID: 2d276e700ba646c4ad42566929ac5cd9; DNP: false
U36 = SN74AXC4T245PWR: 数据速率:380Mbps;工作电压(VCCA):650mV~3.6V;工作电压(VCCB):650mV~3.6V;元件数:2;每个电路通道数:2;; LCSC Part Name: 具有可配置电压转换和三态输出的四位总线收发器; Supplier Part: C2867798; Manufacturer: TI(德州仪器); Supplier Footprint: TSSOP-16; JLCPCB Part Class: Extended Part; Datasheet: https://www.ti.com/cn/lit/ds/symlink/sn74axc4t245.pdf; Supplier: LCSC; Channel Type: 双向; Data Rate: 380Mbps; Voltage - Supply(VCCA): 650mV~3.6V; Voltage - Supply(VCCB): 650mV~3.6V; Number of Elements: 2; Number of Circuits: 2; Output Type: 三态; Operating Temperature: -40℃~+125℃; Features: 输出使能高阻；断电保护; Translator Type: 电平转换器; Catalog UUID: e8dcc5207ab541a8adf7fd60da8ef59a; DNP: false
C59 C60 C68 C69 = GRM21BR61H106KE43L: 容值:10uF;精度:±10%;额定电压:50V;温度系数:X5R;; LCSC Part Name: 10uF ±10% 50V; Supplier Part: C440198; Manufacturer: muRata(村田); Supplier Footprint: 0805; JLCPCB Part Class: Basic Part; Datasheet: https://item.szlcsc.com/datasheet/GRM21BR61H106KE43L/439567.html; Supplier: LCSC; Tolerance: ±10%; Voltage Rating: 50V; Temperature Coefficient: X5R; Catalog UUID: 6e5726223dd84f70bc3b626fc7d1f72c; DNP: false
C61 C70 = CL10B224KA8NNNC: 容值:220nF;精度:±10%;额定电压:25V;温度系数:X7R;; LCSC Part Name: 220nF ±10% 25V; Supplier Part: C21120; Manufacturer: SAMSUNG(三星); Supplier Footprint: 0603; JLCPCB Part Class: Basic Part; Datasheet: https://item.szlcsc.com/datasheet/CL10B224KA8NNNC/21832.html; Supplier: LCSC; Tolerance: ±10%; Voltage Rating: 25V; Temperature Coefficient: X7R; Catalog UUID: a744235dbf374602b2efc75e41a2a614; DNP: false
C62-C65 C71-C74 = CL31A226KAHNNNE: 容值:22uF;精度:±10%;额定电压:25V;温度系数:X5R;; LCSC Part Name: 22uF ±10% 25V; Supplier Part: C12891; Manufacturer: SAMSUNG(三星); Supplier Footprint: 1206; JLCPCB Part Class: Basic Part; Datasheet: https://item.szlcsc.com/datasheet/CL31A226KAHNNNE/13537.html; Supplier: LCSC; Tolerance: ±10%; Voltage Rating: 25V; Temperature Coefficient: X5R; Catalog UUID: 0de9d28bbcd34ca3bf2a4d78faaa50bb; DNP: false
J2 = XH-3A: 插针结构:1x3P;间距:2.5mm;安装方式:直插;参考系列:XH;总PIN数:3P;排数:1;每排PIN数:3;行距:-;额定电流:3A;触头材质:黄铜;触头镀层:锡;工作温度:-25℃~+85℃;; LCSC Part Name: 1x3P 间距:2.5mm 直插 系列:XH; Supplier Part: C2908601; Manufacturer: HCTL(华灿天禄); Supplier Footprint: 插件,P=2.5mm; JLCPCB Part Class: Extended Part; Datasheet: https://item.szlcsc.com/datasheet/XH-3A/3184372.html; Supplier: LCSC; Pins Structure: 1x3P; Pitch: 2.5mm; Mounting Type: 直插; Reference Series: XH; Number of Pins: 3P; Number of Rows: 1; Number of PINs Per Row: 3; Current Rating: 3A; Contact Material: 黄铜; Contact Plating: 锡; Operating Temperature: -25℃~+85℃; Voltage Rating: 250V; Plastic Material: PA66; Flame Retardant Rating: UL94V-0; Z-Height of the Board: 7mm; Y-Width of Bottom Edge on Board: 5.9mm; Catalog UUID: 6934d76a8ee6438388dad49508dc5ccf; DNP: false; Engineering Note: Dedicated USB power harness to 7B; no signal header power. USB host backfeed still requires kit power-path audit
L1 L2 = MPL-AL5030-2R2: LCSC Part Name: 2.2uH 11A; Supplier Part: C3224757; Manufacturer: MPS(芯源); Supplier Footprint: SMD,5.5x5.3mm; JLCPCB Part Class: Extended Part; Datasheet: https://item.szlcsc.com/datasheet/MPL-AL5030-2R2/3787776.html; Supplier: LCSC; Tolerance: ±20%; Current Rating: 8.2A; Current - Saturation(Isat): 11A; DC Resistance(DCR): 12.3mΩ; Type: 一体成型电感; Catalog UUID: 051cb86f2729459da69f02e5aa6e6c88; DNP: false
Q3 = CSD17578Q5A: 数量:1个N沟道;漏源电压(Vdss):30V;连续漏极电流(Id):25A;导通电阻(RDS(on)):6.9mΩ@10V;耗散功率(Pd):42W；3.1W;阈值电压(Vgs(th)):1.9V;; LCSC Part Name: 1个N沟道 耐压:30V 电流:25A; Supplier Part: C2871447; Manufacturer: TI(德州仪器); Supplier Footprint: VSONP-8(5x6); JLCPCB Part Class: Extended Part; Datasheet: https://www.ti.com/cn/lit/ds/symlink/csd17578q5a.pdf; Supplier: LCSC; Number: 1个N沟道; Drain to Source Voltage: 30V; Current - Continuous Drain(Id): 25A; RDS(on): 6.9mΩ@10V; Pd - Power Dissipation: 42W；3.1W; Gate Threshold Voltage (Vgs(th)): 1.9V; Gate Charge(Qg): 22.3nC@10V; Input Capacitance(Ciss): 1.51nF; Operating Temperature: -55℃~+150℃; Catalog UUID: 1b826b2ccd1646e3801d1632f084fdc1; DNP: false; Engineering Note: Library pad9 is drain thermal pad; connected to CATHODE/output
R131 = 0603WAF2492T5E: 电阻类型:厚膜电阻;阻值:24.9kΩ;精度:±1%;功率:100mW;工作电压:75V;温度系数:±100ppm/℃;; LCSC Part Name: 厚膜电阻 24.9kΩ ±1%; Supplier Part: C25962; Manufacturer: UNI-ROYAL(厚声); Supplier Footprint: 0603; JLCPCB Part Class: Extended Part; Datasheet: https://item.szlcsc.com/datasheet/0603WAF2492T5E/26705.html; Supplier: LCSC; Type: 厚膜电阻; Tolerance: ±1%; Power(Watts): 100mW; Voltage-Supply(Max): 75V; Temperature Coefficient: ±100ppm/℃; Operating Temperature: -55℃~+155℃; Catalog UUID: b2971cc3af7a4f8390de33e72133f9d0; DNP: false
R133 = 0603WAF4322T5E: 电阻类型:厚膜电阻;阻值:43.2kΩ;精度:±1%;功率:100mW;工作电压:75V;温度系数:±100ppm/℃;; LCSC Part Name: 43.2kΩ ±1% 100mW 厚膜电阻; Supplier Part: C23053; Manufacturer: UNI-ROYAL(厚声); Supplier Footprint: 0603; JLCPCB Part Class: Extended Part; Datasheet: https://item.szlcsc.com/datasheet/0603WAF4322T5E/23780.html; Supplier: LCSC; Type: 厚膜电阻; Tolerance: ±1%; Power(Watts): 100mW; Voltage-Supply(Max): 75V; Temperature Coefficient: ±100ppm/℃; Operating Temperature: -55℃~+155℃; Catalog UUID: 6c7e979591d2419aa050f4ee96b6e4fd; DNP: false
U32 U33 = LMR33630BDDAR: 功能类型:降压型;工作电压:3.8V~36V;输出电压:1V~24V;输出电流:3A;输出类型:可调;; LCSC Part Name: 降压型 3A 3.8V~36V; Supplier Part: C544370; Manufacturer: TI(德州仪器); Supplier Footprint: SOIC-8-EP; JLCPCB Part Class: Extended Part; Datasheet: https://www.ti.com/cn/lit/ds/symlink/lmr33630.pdf; Supplier: LCSC; Function: 降压型; Voltage - Supply: 3.8V~36V; Output Voltage: 1V~24V; Output Current: 3A; Frequency - Switching: 1.4MHz; Operating Temperature: -40℃~+125℃@(TJ); Synchronous Rectifier: 是; Number of Outputs: 1; Topology: 降压式; Quiescent Current: 24uA; Switch tube (built-in/external): 内置; Output Type: 可调; Features: 轻载高效模式；内置LDO稳压器；逐波限流；工作状态指示；打嗝限流; Catalog UUID: 289d2d43612c4796b500b6c4e9c8a43f; DNP: false; Engineering Note: B=1.4MHz, industrial HSOIC8; not Q1 drop-in. EP grounded
U34 = LM74700QDBVRQ1: Supplier Part: C5119029; Supplier Footprint: SOT-23-6; JLCPCB Part Class: Extended Part; Supplier: LCSC; Catalog UUID: c9b4bb9315b649f2997117207bf00dd7; DNP: false
R76 R83 = 0603WAF1001T5E: 电阻类型:厚膜电阻;阻值:1kΩ;精度:±1%;功率:100mW;工作电压:75V;温度系数:±100ppm/℃;; LCSC Part Name: 1kΩ ±1% 100mW 厚膜电阻; Supplier Part: C21190; Manufacturer: UNI-ROYAL(厚声); Supplier Footprint: 0603; JLCPCB Part Class: Basic Part; Datasheet: https://item.szlcsc.com/datasheet/0603WAF1001T5E/21904.html; Supplier: LCSC; Type: 厚膜电阻; Tolerance: ±1%; Power(Watts): 100mW; Voltage-Supply(Max): 75V; Temperature Coefficient: ±100ppm/℃; Operating Temperature: -55℃~+155℃; Catalog UUID: 18db11499a04403ba8c98e2f7a687fbc; DNP: false
R77 R84 = 0603WAF4701T5E: 电阻类型:厚膜电阻;阻值:4.7kΩ;精度:±1%;功率:100mW;工作电压:75V;温度系数:±100ppm/℃;; LCSC Part Name: 厚膜电阻 4.7kΩ ±1%; Supplier Part: C23162; Manufacturer: UNI-ROYAL(厚声); Supplier Footprint: 0603; JLCPCB Part Class: Basic Part; Datasheet: https://item.szlcsc.com/datasheet/0603WAF4701T5E/23889.html; Supplier: LCSC; Type: 厚膜电阻; Tolerance: ±1%; Power(Watts): 100mW; Voltage-Supply(Max): 75V; Temperature Coefficient: ±100ppm/℃; Operating Temperature: -55℃~+155℃; Catalog UUID: 0f0661658cdd4f45888ea39caf7e9650; DNP: false; Engineering Note: 4.7k MCU I/O fault current limiter per TI recommendation; IN and DIAG tied at IC side
R78 R85 = 0603WAF6191T5E: 电阻类型:厚膜电阻;阻值:6.19kΩ;精度:±1%;功率:100mW;工作电压:75V;温度系数:±100ppm/℃;; LCSC Part Name: 厚膜电阻 6.19kΩ ±1%; Supplier Part: C25978; Manufacturer: UNI-ROYAL(厚声); Supplier Footprint: 0603; JLCPCB Part Class: Extended Part; Datasheet: https://item.szlcsc.com/datasheet/0603WAF6191T5E/26721.html; Supplier: LCSC; Type: 厚膜电阻; Tolerance: ±1%; Power(Watts): 100mW; Voltage-Supply(Max): 75V; Temperature Coefficient: ±100ppm/℃; Operating Temperature: -55℃~+155℃; Catalog UUID: 8c2b200f2fe3403a8095e07ce7180a9f; DNP: false
R80 R87 = 0603WAF1200T5E: 电阻类型:厚膜电阻;阻值:120Ω;精度:±1%;功率:100mW;工作电压:75V;温度系数:±100ppm/℃;; LCSC Part Name: 120Ω ±1% 100mW 厚膜电阻; Supplier Part: C22787; Manufacturer: UNI-ROYAL(厚声); Supplier Footprint: 0603; JLCPCB Part Class: Basic Part; Datasheet: https://item.szlcsc.com/datasheet/0603WAF1200T5E/23514.html; Supplier: LCSC; Type: 厚膜电阻; Tolerance: ±1%; Power(Watts): 100mW; Voltage-Supply(Max): 75V; Temperature Coefficient: ±100ppm/℃; Operating Temperature: -55℃~+155℃; Catalog UUID: 70ad7c7d259c46308522db94f14f808c; DNP: true; Engineering Note: DNP until probe end termination measured
R81 R82 R88 R89 = 0603WAF3900T5E: 电阻类型:厚膜电阻;阻值:390Ω;精度:±1%;功率:100mW;工作电压:75V;温度系数:±100ppm/℃;; LCSC Part Name: 厚膜电阻 390Ω ±1%; Supplier Part: C23151; Manufacturer: UNI-ROYAL(厚声); Supplier Footprint: 0603; JLCPCB Part Class: Basic Part; Datasheet: https://item.szlcsc.com/datasheet/0603WAF3900T5E/23878.html; Supplier: LCSC; Type: 厚膜电阻; Tolerance: ±1%; Power(Watts): 100mW; Voltage-Supply(Max): 75V; Temperature Coefficient: ±100ppm/℃; Operating Temperature: -55℃~+155℃; Catalog UUID: 3a149519c47e492384526af469a473e0; DNP: true; Engineering Note: DNP; built-in fail-safe used initially

## Nets
3V3: C5.1 C7.1 C8.1 C9.1 C11.1 C12.1 C13.1 C15.1 C16.1 C21.1 C22.1 C24.1 C71.1 C72.1 C73.1 C74.1 L2.2 R17.1 R18.1 R19.1 R20.1 R21.1 R29.1 R30.1 R31.1 R32.1 R33.1 R41.1 R42.1 R43.1 R44.1 R45.1 R73.1 R74.1 R81.1 R88.1 R132.1 U2.3(3V3) U3.3(3V3) U4.3(3V3) U13.14(VCC) U14.14(VCC) U15.14(VCC) U18.16(VCC) U35.1(VCCA) U36.1(VCCA) U36.3(2DIR) ; also on sheet 1 2 3 4 11 12
5V_BUCK: C62.1 C63.1 C64.1 C65.1 C75.2 L1.2 Q3.1(S) Q3.2(S) Q3.3(S) R130.1 U34.3(EN) U34.6(ANODE) ; also on sheet 2
5V_SCREEN: J2.1 Q3.5(D) Q3.6(D) Q3.7(D) Q3.8(D) Q3.9(D) U34.4(CATHODE)
12V_PROTECTED: C59.1 C60.1 C61.1 C68.1 C69.1 C70.1 R79.1 R86.1 U32.2(VIN) U32.3(EN) U33.2(VIN) U33.3(EN) ; also on sheet 3 4 11 12
GND: C5.2 C6.2 C7.2 C8.2 C9.2 C10.2 C11.2 C12.2 C13.2 C14.2 C15.2 C16.2 C21.2 C22.2 C23.2 C24.2 C25.2 C26.2 C30.2 C34.2 C58.2 C59.2 C60.2 C61.2 C62.2 C63.2 C64.2 C65.2 C67.2 C68.2 C69.2 C70.2 C71.2 C72.2 C73.2 C74.2 C78.2 C79.2 C80.2 C81.2 J2.2 J2.3 J3.11 J4.8 J4.11 J12.3 J12.5 J13.3 J13.5 J14.3 J14.5 Q5.2(S) R22.2 R23.2 R24.2 R34.2 R35.2 R36.2 R46.2 R47.2 R48.2 R62.2 R63.2 R64.2 R65.2 R66.2 R72.2 R75.2 R78.2 R82.2 R85.2 R89.2 R131.2 R133.2 U2.1(GND) U2.2(GND) U2.11(GND) U2.14(GND) U2.36(GND) U2.37(GND) U2.38(GND) U2.39(GND) U2.40(GND) U2.41(GND) U2.42(GND) U2.43(GND) U2.44(GND) U2.45(GND) U2.46(GND) U2.47(GND) U2.48(GND) U2.49(GND) U2.50(GND) U2.51(GND) U2.52(GND) U2.53(GND) U3.1(GND) U3.2(GND) U3.11(GND) U3.14(GND) U3.36(GND) U3.37(GND) U3.38(GND) U3.39(GND) U3.40(GND) U3.41(GND) U3.42(GND) U3.43(GND) U3.44(GND) U3.45(GND) U3.46(GND) U3.47(GND) U3.48(GND) U3.49(GND) U3.50(GND) U3.51(GND) U3.52(GND) U3.53(GND) U4.1(GND) U4.2(GND) U4.11(GND) U4.14(GND) U4.36(GND) U4.37(GND) U4.38(GND) U4.39(GND) U4.40(GND) U4.41(GND) U4.42(GND) U4.43(GND) U4.44(GND) U4.45(GND) U4.46(GND) U4.47(GND) U4.48(GND) U4.49(GND) U4.50(GND) U4.51(GND) U4.52(GND) U4.53(GND) U13.1(1OE) U13.4(2OE) U13.7(GND) U13.10(3OE) U14.1(1OE) U14.4(2OE) U14.7(GND) U14.10(3OE) U15.1(1OE) U15.4(2OE) U15.7(GND) U15.10(3OE) U18.7(G#) U18.8(GND) U18.12(D7) U18.13(D6) U18.14(D5) U32.1(PGND) U32.9(EP) U33.1(PGND) U33.9(EP) U34.2(GND) U35.2(DIR1) U35.11(DIR2) U35.12(GND) U35.13(GND) U36.2(1DIR) U36.8(GND) U36.9(GND) ; also on sheet 1 2 3 4 11 12
B32_BOOT: C57.1 U32.7(BOOT)
B32_FB: R130.2 R131.1 U32.5(FB)
B32_SW: C57.2 L1.1 U32.8(SW)
B32_VCC: C58.1 U32.6(VCC)
B33_BOOT: C66.1 U33.7(BOOT)
B33_FB: R132.2 R133.1 U33.5(FB)
B33_SW: C66.2 L2.1 U33.8(SW)
B33_VCC: C67.1 U33.6(VCC)
BASE_3V3_PG: Q5.1(G) R74.2 R75.1 U33.4(PG)
CS_BRAKE: U35.9(A7) ; also on sheet 2
CS_FL: U35.5(A3) ; also on sheet 1
CS_FR: R17.2 U13.9(3A) U13.13(4OE) U35.6(A4)
CS_RL: R29.2 U14.9(3A) U14.13(4OE) U35.7(A5)
CS_RR: R41.2 U15.9(3A) U15.13(4OE) U35.8(A6)
FL_A: R80.1 R81.2 ; also on sheet 3
FL_ARM: R77.1 ; also on sheet 1 3
FL_B: R80.2 R82.1 ; also on sheet 3
FL_ILIM: R78.1 ; also on sheet 3
FL_POWER_EN: R77.2 ; also on sheet 3
FL_RETRY: R79.2 ; also on sheet 3
FL_RO: R76.1 ; also on sheet 3
FL_RX: R76.2 ; also on sheet 1
FL_VPROBE: C30.1 ; also on sheet 3
FR_A: R87.1 R88.2 ; also on sheet 3
FR_ARM: R22.1 R84.1 U2.30(RXD0) ; also on sheet 3
FR_B: R87.2 R89.1 ; also on sheet 3
FR_BOOT: J12.6 R19.2 U2.23(IO9)
FR_CS: R15.2 U2.18(IO4)
FR_CS_B: R15.1 U13.8(3Y)
FR_DE_CMD: R23.1 U2.21(IO7) ; also on sheet 3
FR_EN: C6.1 J12.4 R18.2 U2.8(EN)
FR_ILIM: R85.1 ; also on sheet 3
FR_MISO: U2.6(IO3) U13.12(4A)
FR_MISO_B: R16.1 U13.11(4Y)
FR_MOSI: R14.2 U2.13(IO1)
FR_MOSI_B: R14.1 U13.6(2Y)
FR_POWER_EN: R84.2 ; also on sheet 3
FR_RETRY: R86.2 ; also on sheet 3
FR_RO: R83.1 ; also on sheet 3
FR_RX: R83.2 U2.16(IO10)
FR_SCK: R13.2 U2.12(IO0)
FR_SCK_B: R13.1 U13.3(1Y)
FR_STRAP2: R21.2 U2.5(IO2)
FR_STRAP8: R20.2 U2.22(IO8)
FR_TX: U2.20(IO6) ; also on sheet 3
FR_USB_DM: C78.1 J12.1 R136.2
FR_USB_DM_MCU: R136.1 U2.26(IO18)
FR_USB_DP: C79.1 J12.2 R137.2
FR_USB_DP_MCU: R137.1 U2.27(IO19)
FR_VPROBE: C34.1 ; also on sheet 3
HOST_MISO: J3.3 U36.11(2B1)
HOST_MISO_INT: R16.2 R28.2 R40.2 R72.1 U36.6(2A1) ; also on sheet 1 2
HOST_MOSI: R66.1 U13.5(2A) U14.5(2A) U15.5(2A) U35.4(A2) ; also on sheet 1 2
HOST_SCK: R65.1 U13.2(1A) U14.2(1A) U15.2(1A) U35.3(A1) ; also on sheet 1 2
IDEAL_CAP: C75.1 U34.1(VCAP)
IDEAL_GATE: Q3.4(G) U34.5(GATE)
LINK_OE_N: Q5.3(D) R73.2 U35.22(OE#) U36.14(2OE#) U36.15(1OE#)
MUX_A: R62.1 U18.11(A) U35.10(A8)
MUX_A_IN: J4.1 U35.14(B8)
MUX_B: R63.1 U18.10(B) U36.4(1A1)
MUX_B_IN: J4.2 U36.13(1B1)
MUX_C: R64.1 U18.9(C) U36.5(1A2)
MUX_C_IN: J4.3 U36.12(1B2)
MUX_Y: U18.5(Y) U36.7(2A2)
MUX_Y_OUT: J4.4 U36.10(2B2)
P4_3V3_REF: C23.1 C25.1 C26.1 J3.12 R67.1 R68.1 R69.1 R70.1 R71.1 U35.23(VCCB) U35.24(VCCB) U36.16(VCCB)
P4_CS_BRAKE: J3.10 R71.2 U35.15(B7)
P4_CS_FL: J3.6 R67.2 U35.19(B3)
P4_CS_FR: J3.7 R68.2 U35.18(B4)
P4_CS_RL: J3.8 R69.2 U35.17(B5)
P4_CS_RR: J3.9 R70.2 U35.16(B6)
P4_MOSI: J3.5 U35.20(B2)
P4_SCK: J3.4 U35.21(B1)
READY_BRAKE: U18.15(D4) ; also on sheet 2
READY_FL: U18.4(D0) ; also on sheet 1
READY_FR: R24.1 U2.19(IO5) U18.3(D1)
READY_RL: R36.1 U3.19(IO5) U18.2(D2)
READY_RR: R48.1 U4.19(IO5) U18.1(D3)
RL_ARM: R34.1 U3.30(RXD0) ; also on sheet 3 11
RL_BOOT: J13.6 R31.2 U3.23(IO9)
RL_CS: R27.2 U3.18(IO4)
RL_CS_B: R27.1 U14.8(3Y)
RL_DE_CMD: R35.1 U3.21(IO7) ; also on sheet 3
RL_EN: C10.1 J13.4 R30.2 U3.8(EN)
RL_MISO: U3.6(IO3) U14.12(4A)
RL_MISO_B: R28.1 U14.11(4Y)
RL_MOSI: R26.2 U3.13(IO1)
RL_MOSI_B: R26.1 U14.6(2Y)
RL_RX: U3.16(IO10) ; also on sheet 11
RL_SCK: R25.2 U3.12(IO0)
RL_SCK_B: R25.1 U14.3(1Y)
RL_STRAP2: R33.2 U3.5(IO2)
RL_STRAP8: R32.2 U3.22(IO8)
RL_TX: U3.20(IO6) ; also on sheet 3
RL_USB_DM: C80.1 J13.1 R138.2
RL_USB_DM_MCU: R138.1 U3.26(IO18)
RL_USB_DP: C81.1 J13.2 R139.2
RL_USB_DP_MCU: R139.1 U3.27(IO19)
RR_ARM: R46.1 U4.30(RXD0) ; also on sheet 3 11
RR_BOOT: J14.6 R43.2 U4.23(IO9)
RR_CS: R39.2 U4.18(IO4)
RR_CS_B: R39.1 U15.8(3Y)
RR_DE_CMD: R47.1 U4.21(IO7) ; also on sheet 3
RR_EN: C14.1 J14.4 R42.2 U4.8(EN)
RR_MISO: U4.6(IO3) U15.12(4A)
RR_MISO_B: R40.1 U15.11(4Y)
RR_MOSI: R38.2 U4.13(IO1)
RR_MOSI_B: R38.1 U15.6(2Y)
RR_RX: U4.16(IO10) ; also on sheet 11
RR_SCK: R37.2 U4.12(IO0)
RR_SCK_B: R37.1 U15.3(1Y)
RR_STRAP2: R45.2 U4.5(IO2)
RR_STRAP8: R44.2 U4.22(IO8)
RR_TX: U4.20(IO6) ; also on sheet 3
RR_USB_DM: J14.1 U4.26(IO18)
RR_USB_DP: J14.2 U4.27(IO19)

Not connected (* = marked no-connect by the designer): J3 1* 2*; J4 5* 6* 7* 9* 10* 12*; U2 4(NC)* 7(NC)* 9(NC)* 10(NC)* 15(NC)* 17(NC)* 24(NC)* 25(NC)* 28(NC)* 29(NC)* 31(TXD0)* 32(NC)* 33(NC)* 34(NC)* 35(NC)*; U3 4(NC)* 7(NC)* 9(NC)* 10(NC)* 15(NC)* 17(NC)* 24(NC)* 25(NC)* 28(NC)* 29(NC)* 31(TXD0)* 32(NC)* 33(NC)* 34(NC)* 35(NC)*; U4 4(NC)* 7(NC)* 9(NC)* 10(NC)* 15(NC)* 17(NC)* 24(NC)* 25(NC)* 28(NC)* 29(NC)* 31(TXD0)* 32(NC)* 33(NC)* 34(NC)* 35(NC)*; U18 6(W)*; U32 4(PG)*

## Notes on the sheets
sheet 5
- 六接口底板 V0.1 | 工程样机草案 · 实物未验证
- 候选硬件：未启用 Approved profile
  跨页信号使用同名网络端口；两条3V3禁止并联
  图纸、网表与PCB须分别审查后才能制造
sheet 6
- 六接口底板 V0.1 | 工程样机草案 · 实物未验证
- 候选硬件：未启用 Approved profile
  跨页信号使用同名网络端口；两条3V3禁止并联
  图纸、网表与PCB须分别审查后才能制造
sheet 7
- 六接口底板 V0.1 | 工程样机草案 · 实物未验证
- 候选硬件：未启用 Approved profile
  跨页信号使用同名网络端口；两条3V3禁止并联
  图纸、网表与PCB须分别审查后才能制造
sheet 8
- 六接口底板 V0.1 | 工程样机草案 · 实物未验证
- 候选硬件：未启用 Approved profile
  跨页信号使用同名网络端口；两条3V3禁止并联
  图纸、网表与PCB须分别审查后才能制造
sheet 9
- 六接口底板 V0.1 | 工程样机草案 · 实物未验证
- 候选硬件：未启用 Approved profile
  跨页信号使用同名网络端口；两条3V3禁止并联
  图纸、网表与PCB须分别审查后才能制造
sheet 10
- 六接口底板 V0.1 | 工程样机草案 · 实物未验证
- 候选硬件：未启用 Approved profile
  跨页信号使用同名网络端口；两条3V3禁止并联
  图纸、网表与PCB须分别审查后才能制造
